# Altium project MVP-Module-Dash-v2.0.PrjPcb (part 8 of 8)
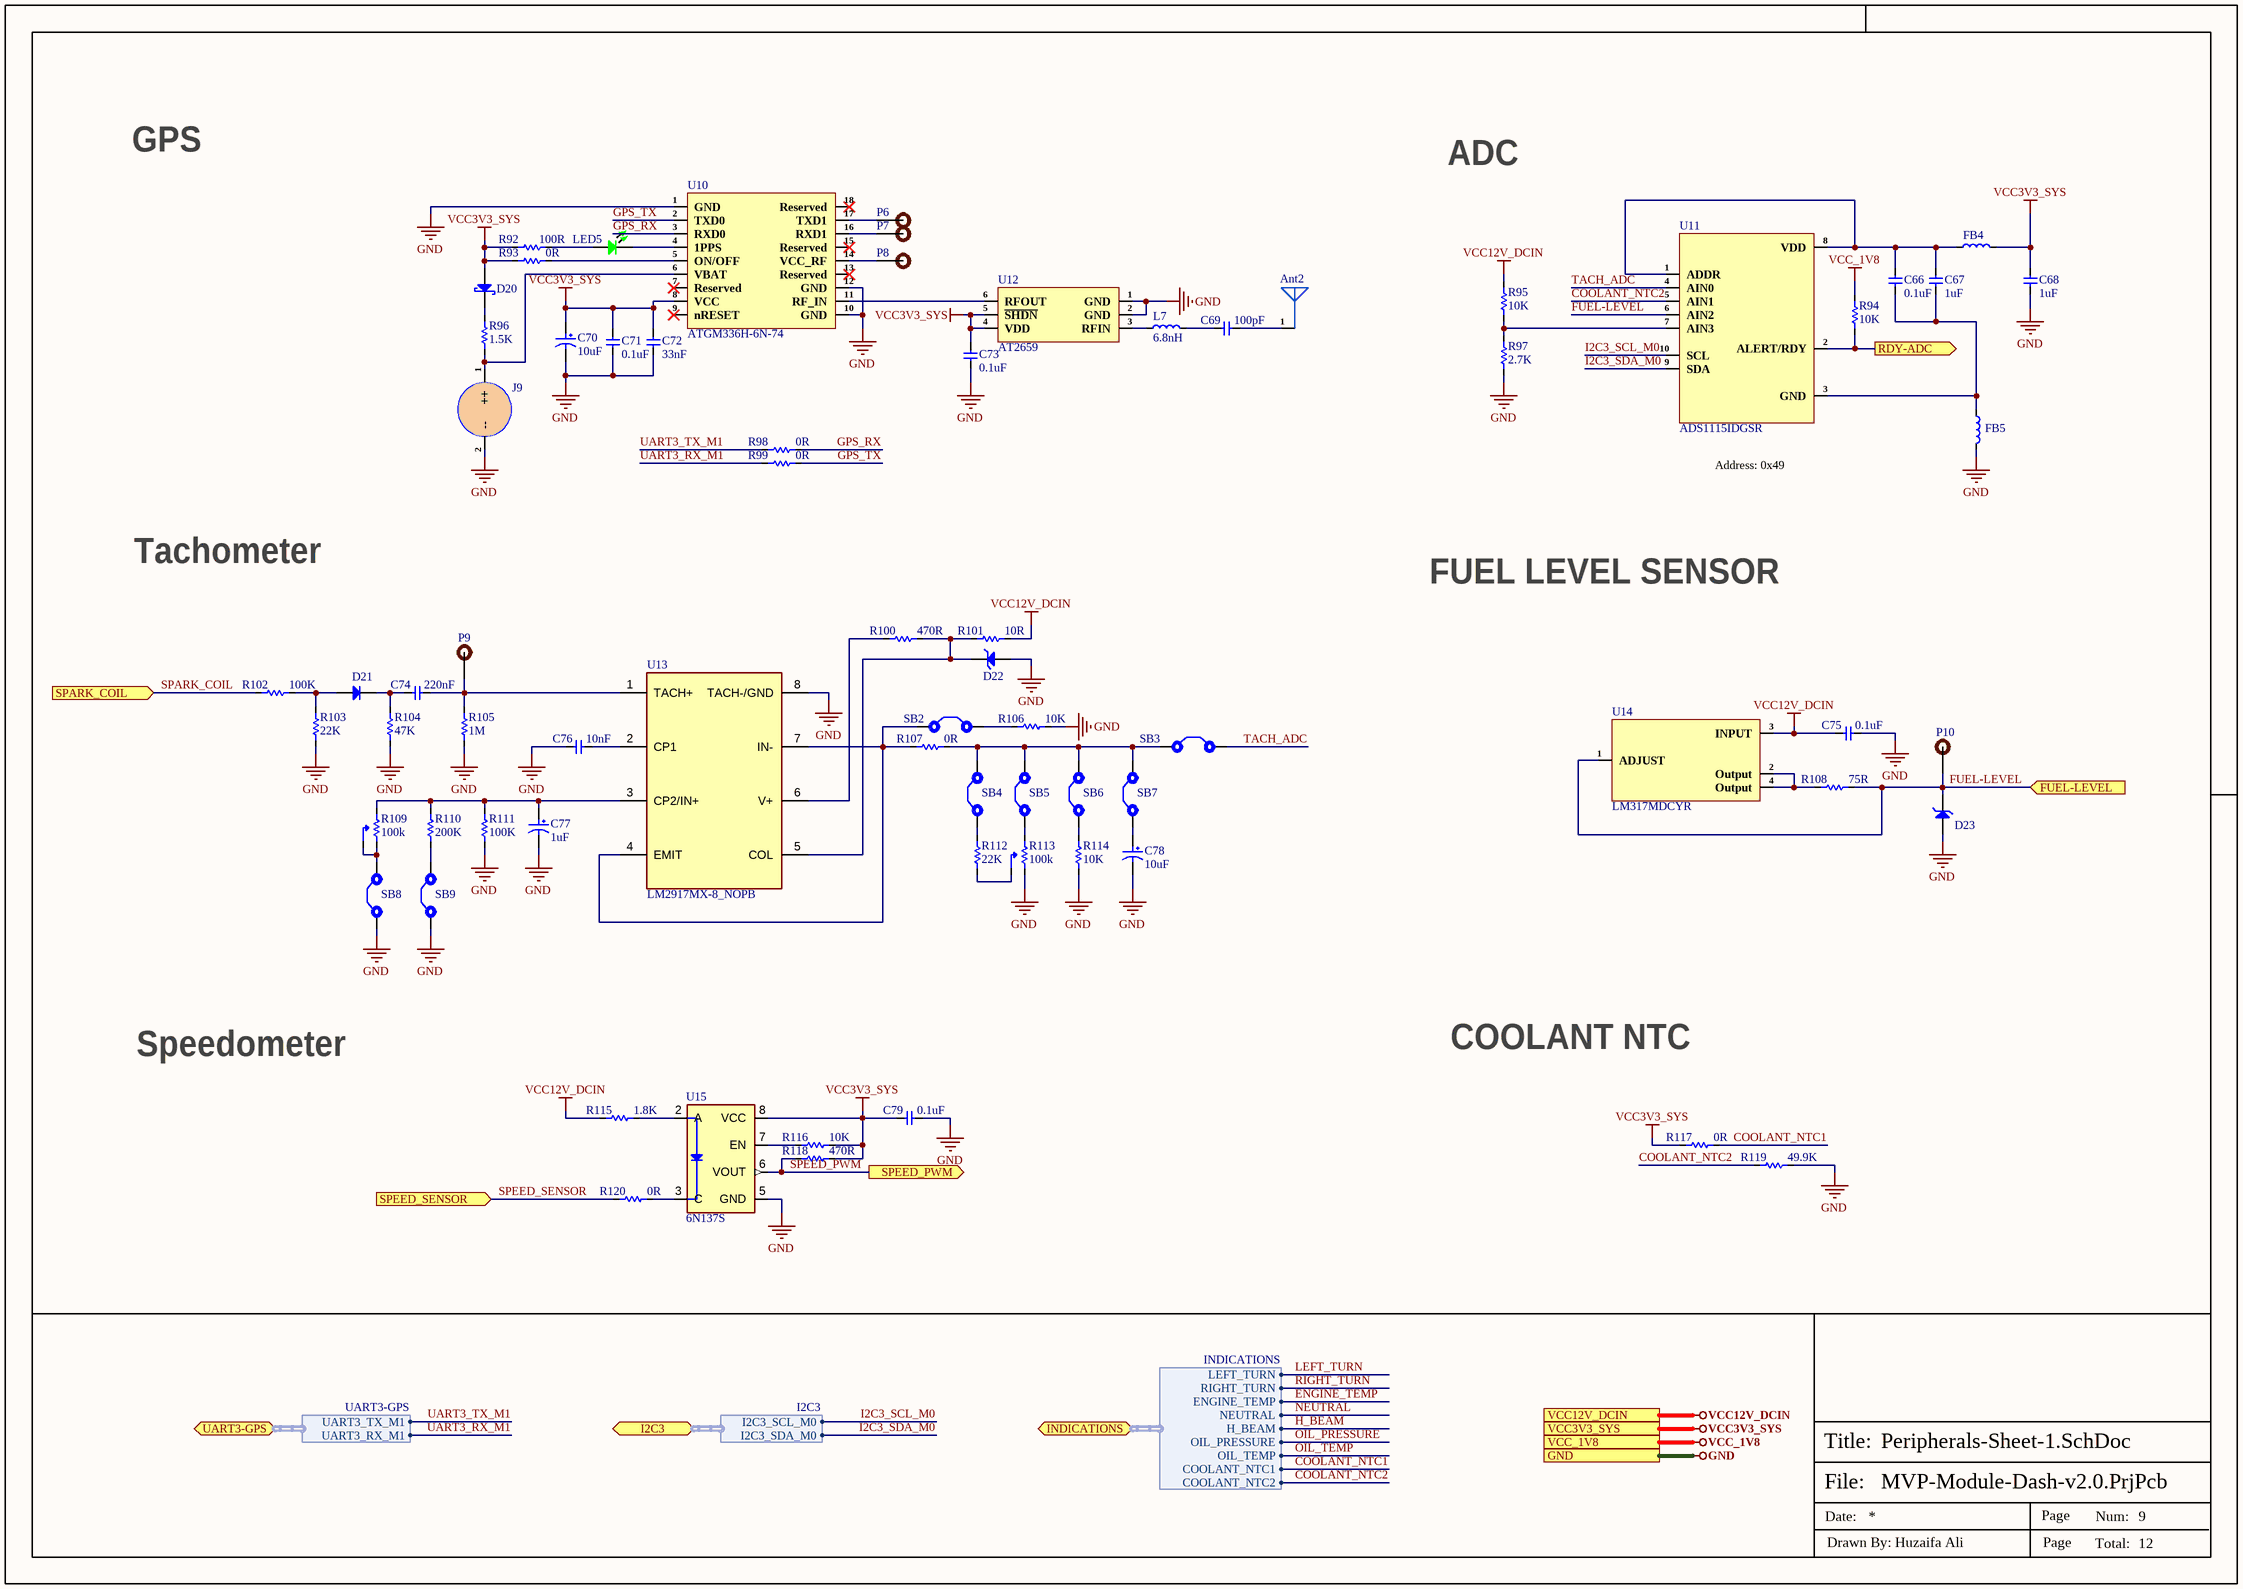
[diagram p15: Peripherals-Sheet-1.SchDoc]

## Sheet Peripherals-Sheet-1.SchDoc (continued)

### Library data of the parts (continued)
R111 = RC0402FR-07100KL: RES 100K OHM 1% 1/16W 0402; Manufacturer: Yageo; Resistance: 100kR; Temperature Coefficient: 100ppm/°C; Power Rating: 63mW; Voltage Rating: 50V; Item Type: Resistor; Supplier 1: Mouser; Manufacturer Part Number: RC0402FR-07100KL; RoHS: Yes; Category: Chip SMD Resistors; Stock 1: 7759549; Pricing 1: 1=0.10000, 10=0.01200, 50=0.01200, 100=0.00500, 1000=0.00300, 2500=0.00200, 10000=0.00100 (USD); Case/Package: 0402; Case Code (Metric): 1005; Case Code (Imperial): 0402; Min Operating Temperature: -55°C; Max Operating Temperature: 155°C; Resistor Type: Thick Film; Tolerance: 1%; Packaging: Tape and Reel; Package Quantity: 1; Number of Terminations: 2; Termination: SMD/SMT; Max Power Dissipation: 63mW; Working Voltage: 50V; Features: Moisture Resistant; Series: RC; Resistance Tolerance: 1%; Construction: Rectangular; Technology: THICK FILM; Length: 0.039inch; Width: 0.02inch; Height: 0.016inch; Depth: 0.5mm; REACH SVHC: No SVHC; Lead Free: Lead Free; RoHS Compliant: Yes; Military Standard: Not; ComponentLink1URL: https://datasheet.ciiva.com/11819/0900766b80c66297-11819452.pdf?src-supplier=RSComponents; ComponentLink1Description: https://datasheet.ciiva.com/11819/0900766b80c66297-11819452.pdf?src-supplier=RSComponents; ComponentLink2URL: https://datasheet.ciiva.com/22747/1018594-22747509.pdf?src-supplier=Element14; ComponentLink2Description: https://datasheet.ciiva.com/22747/1018594-22747509.pdf?src-supplier=Element14; ComponentLink3URL: https://datasheet.ciiva.com/2453/pyu-r-int-thick-7-2453362.pdf?src-supplier=Digi-Key; ComponentLink3Description: https://datasheet.ciiva.com/2453/pyu-r-int-thick-7-2453362.pdf?src-supplier=Digi-Key; ComponentLink4URL: https://datasheet.ciiva.com/2453/pyu-r-int-thick-7-2453363.pdf?src-supplier=Digi-Key; ComponentLink4Description: https://datasheet.ciiva.com/2453/pyu-r-int-thick-7-2453363.pdf?src-supplier=Digi-Key; ComponentLink5URL: https://datasheet.ciiva.com/2453/pyu-r-int-thick-7-2453361.pdf?src-supplier=Digi-Key; ComponentLink5Description: https://datasheet.ciiva.com/2453/pyu-r-int-thick-7-2453361.pdf?src-supplier=Digi-Key; ComponentLink6URL: https://datasheet.ciiva.com/12667/pyu-rc0402-51-rohs-l-6-r-12667930.pdf?src-supplier=Mouser; ComponentLink6Description: https://datasheet.ciiva.com/12667/pyu-rc0402-51-rohs-l-6-r-12667930.pdf?src-supplier=Mouser; ComponentLink7URL: https://datasheet.ciiva.com/15189/getdatasheetpartid-323696-15189334.pdf?src-supplier=Verical; ComponentLink7Description: https://datasheet.ciiva.com/15189/getdatasheetpartid-323696-15189334.pdf?src-supplier=Verical; Supplier Part Number 1: 603-RC0402FR-07100KL; LCSC Part Number: C60491
R115 = RC0402FR-071K8L: RES 1.8K OHM 1% 1/16W 0402; Manufacturer: Yageo; Item Type: Resistors; Supplier: Digikey; Supplier Part Number: 311-1.80KLRCT-ND; Manufacturer Part Number: RC0402FR-071K8L; RoHS: Yes; Stock: 584354; Pricing: 1=0.1, 10=0.015, 50=0.0088, 100=0.0073, 500=0.00488, 1000=0.00417, 5000=0.00297 (USD); Lead Free: 5697LeadFree; LCSC Part Number: C163481
R118 = RC0402FR-07470RL: RES 470 OHM 1% 1/16W 0402; Manufacturer: Yageo; Item Type: Resistor; Voltage Rating: 50V; Power Rating: 62.5mW; Temperature Coefficient: 100ppm/°C; Max Power Dissipation: 63mW; Supplier: Avnet; Supplier Part Number: RC0402FR-07470RL; Manufacturer Part Number: RC0402FR-07470RL; RoHS: Yes; Stock: 10000; Pricing: 10000=0.00085 (USD); Case/Package: 0402; Case Code (Metric): 1005; Case Code (Imperial): 0402; Min Operating Temperature: -55°C; Max Operating Temperature: 155°C; Packaging: Tape and Reel; Value: 470R; Tolerance: 1%; Number of Terminations: 2; Working Voltage: 50V; Package Quantity: 1; Resistor Type: Thick Film; Termination: SMD/SMT; Features: Moisture Resistant; Series: RC; Resistance Tolerance: 1%; Construction: Rectangular; Voltage Rating (AC): 50V; Length: 1mm; Width: 0.02inch; Height: 0.016inch; Depth: 0.5mm; Lead Free: Lead Free; Reach SVHC Compliant: No; RoHS Compliant: Yes; Military Standard: Not; ComponentLink1URL: https://datasheet.ciiva.com/46412/1018594-46412838.pdf?src-supplier=Element14; ComponentLink1Description: https://datasheet.ciiva.com/46412/1018594-46412838.pdf?src-supplier=Element14; ComponentLink2URL: https://datasheet.ciiva.com/2453/pyu-r-int-thick-7-2453377.pdf?src-supplier=Digikey; ComponentLink2Description: https://datasheet.ciiva.com/2453/pyu-r-int-thick-7-2453377.pdf?src-supplier=Digikey; ComponentLink3URL: https://datasheet.ciiva.com/2453/pyu-r-int-thick-7-2453378.pdf?src-supplier=Digikey; ComponentLink3Description: https://datasheet.ciiva.com/2453/pyu-r-int-thick-7-2453378.pdf?src-supplier=Digikey; ComponentLink4URL: https://datasheet.ciiva.com/2453/pyu-r-int-thick-7-2453376.pdf?src-supplier=Digikey; ComponentLink4Description: https://datasheet.ciiva.com/2453/pyu-r-int-thick-7-2453376.pdf?src-supplier=Digikey; ComponentLink5URL: https://datasheet.ciiva.com/7850/1018594-7850015.pdf?src-supplier=Element14; ComponentLink5Description: https://datasheet.ciiva.com/7850/1018594-7850015.pdf?src-supplier=Element14; ComponentLink6URL: https://datasheet.ciiva.com/7850/1018594-7850014.pdf?src-supplier=Element14; ComponentLink6Description: https://datasheet.ciiva.com/7850/1018594-7850014.pdf?src-supplier=Element14; ComponentLink7URL: https://datasheet.ciiva.com/15189/getdatasheetpartid-330246-15189463.pdf?src-supplier=Verical; ComponentLink7Description: https://datasheet.ciiva.com/15189/getdatasheetpartid-330246-15189463.pdf?src-supplier=Verical; LCSC Part Number: C114877
R119 = RC0402FR-0749K9L: RES 49.9K OHM 1% 1/16W 0402; Manufacturer: Yageo; Power Rating: 62.5mW; Value: 49.9kR; Voltage Rating: 50V; Temperature Coefficient: 100ppm/°C; Max Power Dissipation: 63mW; Item Type: Resistor; Supplier: Digikey; Supplier Part Number: 311-49.9KLRCT-ND; Manufacturer Part Number: RC0402FR-0749K9L; RoHS: Yes; Category: Chip SMD Resistors; Stock: 5084418; Pricing: 1=0.1, 10=0.015, 50=0.0088, 100=0.0073, 500=0.00488, 1000=0.00417, 5000=0.00297 (USD); Case/Package: 0402; Case Code (Imperial): 0402; Case Code (Metric): 1005; Min Operating Temperature: -55°C; Max Operating Temperature: 155°C; Tolerance: 1%; Packaging: Tape and Reel; Termination: SMD/SMT; Voltage Rating (DC): 50V; Features: Moisture Resistant; Series: RC; Number of Terminations: 2; Construction: Rectangular; Length: 1mm; Depth: 0.5mm; RoHS Compliant: Yes; Military Standard: Not; Lead Free: Lead Free; ComponentLink1URL: https://datasheet.ciiva.com/17071/pyu-rc0402-51-rohs-l-6-r-17071066.pdf?src-supplier=Future+Electronics; ComponentLink1Description: https://datasheet.ciiva.com/17071/pyu-rc0402-51-rohs-l-6-r-17071066.pdf?src-supplier=Future+Electronics; LCSC Part Number: C137969
R120 = RC0402FR-070RL: RES 0 OHM JUMPER 1/16W 0402; Manufacturer: Yageo; Item Type: Resistors; Tolerance: 1%; Power Rating: 62.5mW; Voltage Rating: 50V; Temperature Coefficient: 200ppm/°C; Max Power Dissipation: 63mW; Supplier 1: Mouser; Manufacturer Part Number: RC0402FR-070RL; RoHS: Yes; Stock 1: 8556842; Pricing 1: 1=0.10000, 10=0.01400, 50=0.01400, 100=0.00600, 1000=0.00300, 5000=0.00200, 10000=0.00100 (USD); Mount: Surface Mount; Case/Package: 0402; Contact Plating: Tin,Matte; Case Code (Imperial): 0402; Case Code (Metric): 1005; Size Code: 0402; Min Operating Temperature: -55°C; Max Operating Temperature: 155°C; Resistance: 0R; Resistor Type: Thick Film; Packaging: Tape and Reel; Termination: SMD/SMT; Features: Moisture Resistant; Series: RC; Number of Terminations: 2; Length: 1mm; Width: 0.5mm; Height: 0.35mm; Radiation Hardening: No; Lead Free: Lead Free; RoHS Compliant: Yes; ComponentLink1URL: https://datasheet.ciiva.com/8896/pyu-rc0402-51-rohs-l-6-8896149.pdf?src-supplier=Avnet; ComponentLink1Description: https://datasheet.ciiva.com/8896/pyu-rc0402-51-rohs-l-6-8896149.pdf?src-supplier=Avnet; ComponentLink2URL: https://datasheet.ciiva.com/16790/pyu-rc0402-51-rohs-l-6-r-16790444.pdf?src-supplier=Future+Electronics; ComponentLink2Description: https://datasheet.ciiva.com/16790/pyu-rc0402-51-rohs-l-6-r-16790444.pdf?src-supplier=Future+Electronics; Supplier Part Number 1: 603-RC0402FR-070RL; LCSC Part Number: C106231
SB2-SB9 = Solder Bridge 0603: Solder Bridge ON; Manufacturer Part Number: Solder Bridge; Item Type: Solder Bridge
U10 = ATGM336H-6N-74: SMD,10.1x9.7mm Satellite Positioning Modules ROHS; Manufacturer: ZHONGKEWEI; Manufacturer Part Number: ATGM336H-6N-74; Package: SMD,10.1x9.7mm; LCSC Part Number: C5804601; ComponentLink1Description: LCSC; ComponentLink1URL: https://www.lcsc.com/product-detail/Satellite-Positioning-Modules_ZHONGKEWEI-ATGM336H-6N-74_C5804601.html
U11 = ADS1115IDGSR: IC ADC 16BIT SIGMA-DELTA 10VSSOP; Manufacturer: Texas Instruments; Interface: I2C; Number of Bits: 16; Sampling Rate: 860S/s; Number of A/D Converters: 1; Resolution: 16b; Polarity: Bipolar; Min Supply Voltage: 2V; Max Supply Voltage: 5.5V; Supply Type: Single; Conversion Rate: 0.86KS/s; Number of Inputs: 4; Integral Nonlinearity (INL): 1LSB; Power Dissipation: 900uW; Nominal Supply Current: 150uA; Number of Channels: 2; Supplier: Mouser; Supplier Part Number: 595-ADS1115IDGSR; Manufacturer Part Number: ADS1115IDGSR; RoHS: Yes; Category: Analog to Digital Converters (ADCs); Stock: 5925; Pricing: 1=5.44, 10=4.76, 50=4.76, 100=4.01, 1000=2.88, 10000=2.78 (USD); Case/Package: VSSOP; Pins: 10; Contact Plating: Gold; Min Operating Temperature: -40°C; Max Operating Temperature: 125°C; Package Quantity: 2500; Packaging: Tape and Reel; Number of Converters: 1; Max Supply Voltage (DC): 5.5V; Min Supply Voltage (DC): 2V; Series: -; Length: 3mm; Width: 3mm; Height: 1.07mm; Thickness: 1.02mm; Reach SVHC Compliant: No; Lead Free: Lead Free; RoHS Compliant: Yes; ComponentLink1URL: https://datasheet.ciiva.com/4031/47725463s8438921n7713-4031028.pdf?src-supplier=Arrow+Electronics; ComponentLink1Description: https://datasheet.ciiva.com/4031/47725463s8438921n7713-4031028.pdf?src-supplier=Arrow+Electronics; LCSC Part Number: C37593; Item Type: IC
U12 = AT2659: 1.4V~3.6V 4.3mA DFN-6(1x1.6) Low Noise Amplifiers (LNA) - RF ROHS; Manufacturer: ZHONGKEWEI; Manufacturer Part Number: AT2659; Package: DFN-6(1x1.6); LCSC Part Number: C92450; Item Type: LNA; ComponentLink1Description: LCSC; ComponentLink1URL: https://www.lcsc.com/product-detail/Low-Noise-Amplifiers-LNA-RF_ZHONGKEWEI-AT2659_C92450.html
U13 = LM2917MX-8_NOPB: Frequency to Voltage Converter; Manufacturer_Name: Texas Instruments; Manufacturer_Part_Number: LM2917MX-8/NOPB; Geometry.Height: 1.75mm; Mouser Part Number: 926-LM2917MX-8/NOPB; Mouser Price/Stock: https://www.mouser.co.uk/ProductDetail/Texas-Instruments/LM2917MX-8-NOPB?qs=X1J7HmVL2ZFWM%2FK6eX0xZQ%3D%3D; Datasheet Link: http://www.ti.com/lit/gpn/LM2917-N
U14 = LM317MDCYR: IC REG LIN POS ADJ 500MA SOT223; Manufacturer: Texas Instruments; Output Voltage: 37V; Number of Outputs: 1; Min Input Voltage: 4.2V; Max Supply Voltage: 40V; Polarity: Positive; Min Output Voltage: 1.25V; Quiescent Current: 3.5mA; Output Type: Adjustable; Reference Voltage: 1.3V; Power Supply Rejection Ratio (PSRR): 80dB; Supplier: Mouser; Supplier Part Number: 595-LM317MDCYR; Manufacturer Part Number: LM317MDCYR; RoHS: Yes; Category: Voltage Regulators - Linear; Stock: 12890; Pricing: 1=0.67, 10=0.564, 50=0.564, 100=0.428, 500=0.359, 1000=0.283, 2500=0.263, 5000=0.245, 10000=0.236, 25000=0.227 (USD); Mounting Technology: Surface Mount; Case/Package: SOT-223-4; Pins: 4; Weight: 0.006632oz; Min Operating Temperature: -40°C; Max Operating Temperature: 125°C; Packaging: Tape and Reel; Output Current: 500mA; Number of Regulators: 1; Max Output Voltage: 37V; Package Quantity: 1; Max Output current: 500mA; Series: -; Radiation Hardening: No; Reach SVHC Compliant: No; Lead Free: Lead Free; RoHS Compliant: Yes; ComponentLink1URL: https://datasheet.ciiva.com/1643/755612-1643356.pdf?src-supplier=Newark; ComponentLink1Description: https://datasheet.ciiva.com/1643/755612-1643356.pdf?src-supplier=Newark; ComponentLink2URL: https://datasheet.ciiva.com/41458/001014040-da-01-en-ic-reg-adj-0-5-lm317mdcyr-sot-223-4-tid-41458215.pdf?src-supplier=Conrad; ComponentLink2Description: https://datasheet.ciiva.com/41458/001014040-da-01-en-ic-reg-adj-0-5-lm317mdcyr-sot-223-4-tid-41458215.pdf?src-supplier=Conrad; ComponentLink3URL: https://datasheet.ciiva.com/1512/1814942-1512040.pdf?src-supplier=Element14; ComponentLink3Description: https://datasheet.ciiva.com/1512/1814942-1512040.pdf?src-supplier=Element14; ComponentLink4URL: https://datasheet.ciiva.com/46398/755612-46398903.pdf?src-supplier=Element14; ComponentLink4Description: https://datasheet.ciiva.com/46398/755612-46398903.pdf?src-supplier=Element14; ComponentLink5URL: https://datasheet.ciiva.com/46419/1814942-46419370.pdf?src-supplier=Element14; ComponentLink5Description: https://datasheet.ciiva.com/46419/1814942-46419370.pdf?src-supplier=Element14; ComponentLink6URL: https://datasheet.ciiva.com/2042/lm317m-2042100.pdf?src-supplier=Digikey; ComponentLink6Description: https://datasheet.ciiva.com/2042/lm317m-2042100.pdf?src-supplier=Digikey; ComponentLink7URL: https://datasheet.ciiva.com/2042/lm317m-2042099.pdf?src-supplier=Digikey; ComponentLink7Description: https://datasheet.ciiva.com/2042/lm317m-2042099.pdf?src-supplier=Digikey; ComponentLink8URL: https://datasheet.ciiva.com/2042/lm317m-2042101.pdf?src-supplier=Digikey; ComponentLink8Description: https://datasheet.ciiva.com/2042/lm317m-2042101.pdf?src-supplier=Digikey; ComponentLink9URL: https://datasheet.ciiva.com/14280/lm317mq-14280776.pdf?src-supplier=Avnet; ComponentLink9Description: https://datasheet.ciiva.com/14280/lm317mq-14280776.pdf?src-supplier=Avnet; LCSC Part Number: C840113; Item Type: IC
U15 = 6N137S: Logic Output Optoisolator 15MBd Open Collector 5000Vrms 1 Channel 10kV/Âµs CMTI 8-SMD; MF: Lite-On Electronics; SnapEDA_Link: https://www.snapeda.com/parts/6N137S/Applied+Avionics/view-part/?ref=snap; Package: SMD-8 Lite-On Inc.; Value: *; MP: 6N137S; Check_prices: https://www.snapeda.com/parts/6N137S/Applied+Avionics/view-part/?ref=eda

## Sheet Peripherals-Sheet-2.SchDoc
size 420 x 297 mm; SheetNumber: 10; SheetTotal: 12
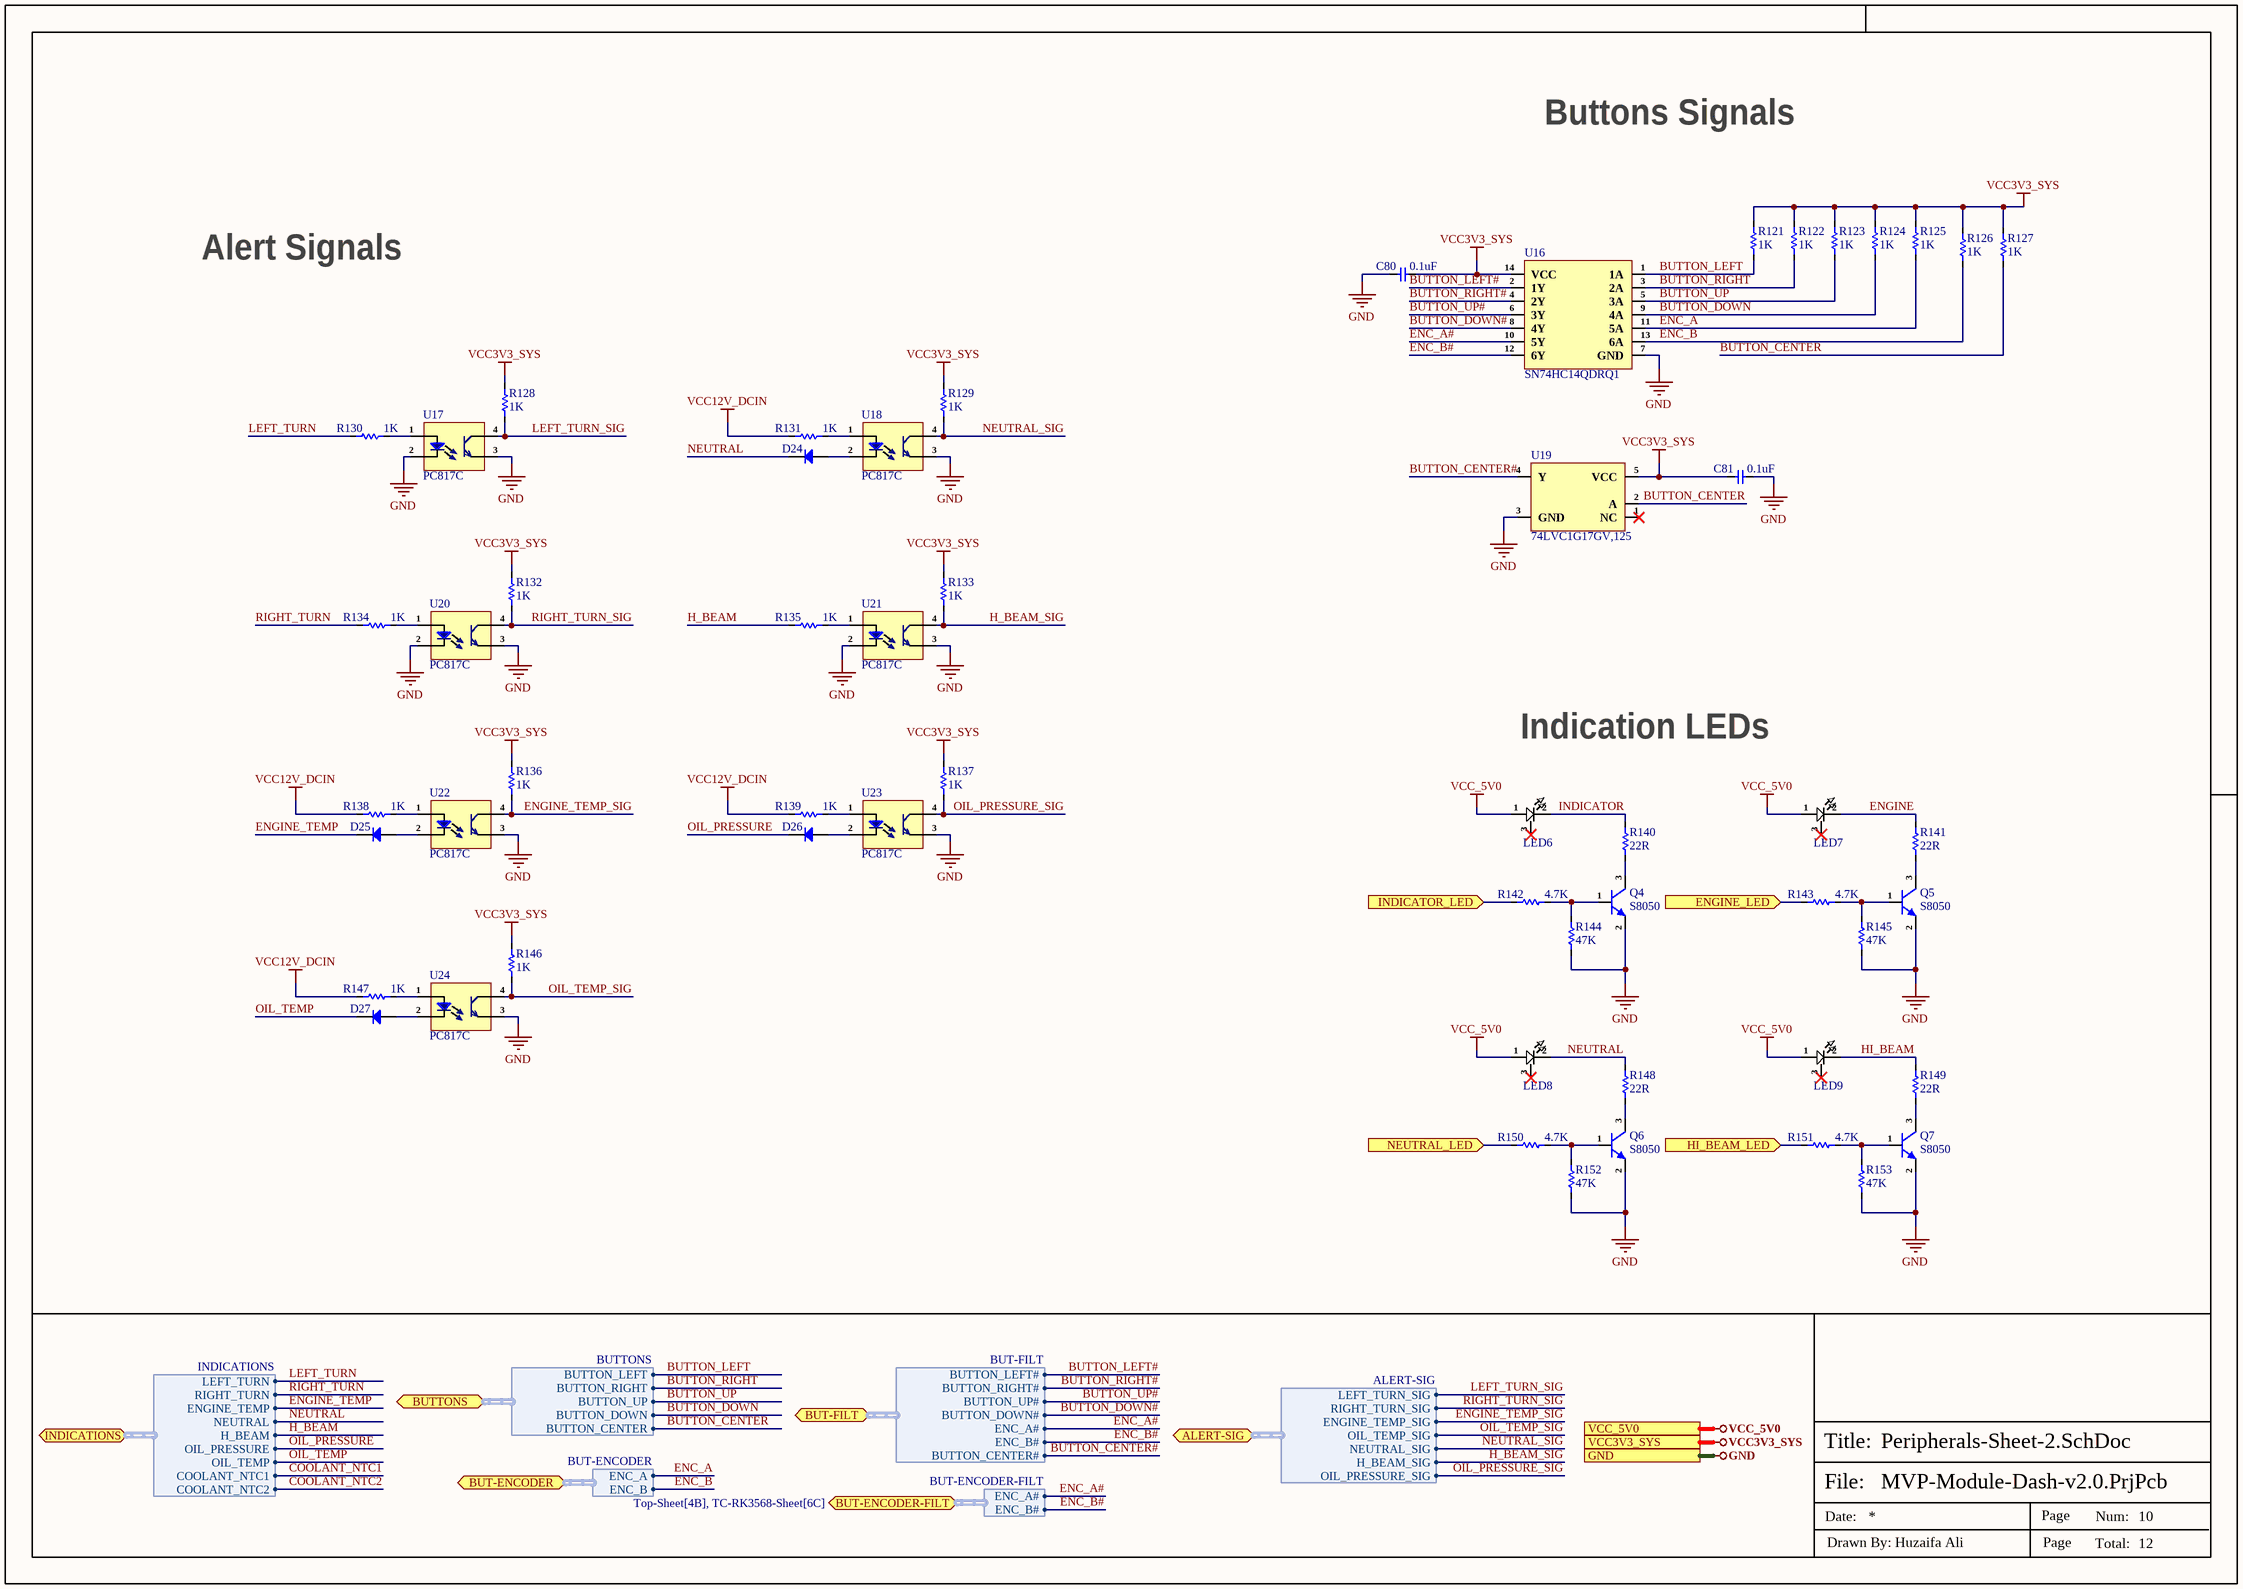
[diagram p12: Peripherals-Sheet-2.SchDoc]

### Parts
C80  0.1uF  [Cap-0402]
C81  0.1uF  [Cap-0402]
D24  1N4148W  [SOD-123]  (value not drawn)
D25  1N4148W  [SOD-123]  (value not drawn)
D26  1N4148W  [SOD-123]  (value not drawn)
D27  1N4148W  [SOD-123]  (value not drawn)
LED6  WHITE  [GW CS8PM1.PM-LRLT-XX52-1-350-R18]  (value not drawn)
LED7  WHITE  [GW CS8PM1.PM-LRLT-XX52-1-350-R18]  (value not drawn)
LED8  WHITE  [GW CS8PM1.PM-LRLT-XX52-1-350-R18]  (value not drawn)
LED9  WHITE  [GW CS8PM1.PM-LRLT-XX52-1-350-R18]  (value not drawn)
Q4  S8050  [SOT-23]
Q5  S8050  [SOT-23]
Q6  S8050  [SOT-23]
Q7  S8050  [SOT-23]
R121  1K  [Res-0402]
R122  1K  [Res-0402]
R123  1K  [Res-0402]
R124  1K  [Res-0402]
R125  1K  [Res-0402]
R126  1K  [Res-0402]
R127  1K  [Res-0402]
R128  1K  [Res-0402]
R129  1K  [Res-0402]
R130  1K  [Res-0402]
R131  1K  [Res-0402]
R132  1K  [Res-0402]
R133  1K  [Res-0402]
R134  1K  [Res-0402]
R135  1K  [Res-0402]
R136  1K  [Res-0402]
R137  1K  [Res-0402]
R138  1K  [Res-0402]
R139  1K  [Res-0402]
R140  22R  [RES-2010]
R141  22R  [RES-2010]
R142  4.7K  [Res-0402]
R143  4.7K  [Res-0402]
R144  47K  [Res-0402]
R145  47K  [Res-0402]
R146  1K  [Res-0402]
R147  1K  [Res-0402]
R148  22R  [RES-2010]
R149  22R  [RES-2010]
R150  4.7K  [Res-0402]
R151  4.7K  [Res-0402]
R152  47K  [Res-0402]
R153  47K  [Res-0402]
U16  SN74HC14QDRQ1  [SOIC-14]
U17  PC817C  [PC817C]
U18  PC817C  [PC817C]
U19  74LVC1G17GV,125  [SC-74A]
U20  PC817C  [PC817C]
U21  PC817C  [PC817C]
U22  PC817C  [PC817C]
U23  PC817C  [PC817C]
U24  PC817C  [PC817C]

### Ports
ALERT-SIG (bidir, harness ALERT-SIG, see Top-Sheet[4B], TC-RK3568-Sheet[5B]), BUT-ENCODER (bidir, harness BUT-ENCODER, see Top-Sheet[6B], Connector-Sheet[4D]), BUT-ENCODER-FILT (bidir, harness BUT-ENCODER-FILT, see Top-Sheet[4B], TC-RK3568-Sheet[6C]), BUT-FILT (bidir, harness BUT-FILT, see Top-Sheet[4B], TC-RK3568-Sheet[5B]), BUTTONS (bidir, harness BUTTONS, see Top-Sheet[6B], Connector-Sheet[2D]), ENGINE_LED (in, see Top-Sheet[4B], TC-RK3568-Sheet[5C]), GND (see Top-Sheet[6B], CAN-Debug-Sheet[5D], Connector-Sheet[5D], HDMI-Sheet[5D], MIPI-Display-Sheet[5D], Peripherals-Sheet-1[5D], Power-Sheet[5D], TC-RK3568-Sheet[5D], TF-Card-Sheet[4D], USB-Sheet[5D], WiFi-Sheet[4D]), HI_BEAM_LED (in, see Top-Sheet[4B], TC-RK3568-Sheet[5C]), INDICATIONS (bidir, harness INDICATIONS, see Top-Sheet[6B], Connector-Sheet[1D], Peripherals-Sheet-1[3D]), INDICATOR_LED (in, see Top-Sheet[4B], TC-RK3568-Sheet[5C]), NEUTRAL_LED (in, see Top-Sheet[4B], TC-RK3568-Sheet[5C]), VCC3V3_SYS (see Top-Sheet[6B], Peripherals-Sheet-1[5D], Power-Sheet[5D], TC-RK3568-Sheet[5D], WiFi-Sheet[4D]), VCC_5V0 (see Top-Sheet[6B], CAN-Debug-Sheet[5D], HDMI-Sheet[5D], MIPI-Display-Sheet[5D], Power-Sheet[5D])

### Harnesses
INDICATIONS: LEFT_TURN, RIGHT_TURN, ENGINE_TEMP, NEUTRAL, H_BEAM, OIL_PRESSURE, OIL_TEMP, COOLANT_NTC1, COOLANT_NTC2
BUTTONS: BUTTON_LEFT, BUTTON_RIGHT, BUTTON_UP, BUTTON_DOWN, BUTTON_CENTER
BUT-ENCODER: ENC_A, ENC_B
BUT-FILT: BUTTON_LEFT#, BUTTON_RIGHT#, BUTTON_UP#, BUTTON_DOWN#, ENC_A#, ENC_B#, BUTTON_CENTER#
ALERT-SIG: LEFT_TURN_SIG, RIGHT_TURN_SIG, ENGINE_TEMP_SIG, OIL_TEMP_SIG, NEUTRAL_SIG, H_BEAM_SIG, OIL_PRESSURE_SIG
BUT-ENCODER-FILT: ENC_A#, ENC_B#

### Nets
GND: C80.2 C81.1 Q4.2(E) Q5.2(E) Q6.2(E) Q7.2(E) R144.1 R145.1 R152.1 R153.1 U16.7(GND) U17.2(Ca) U17.3(E) U18.3(E) U19.3(GND) U20.2(Ca) U20.3(E) U21.2(Ca) U21.3(E) U22.3(E) U23.3(E) U24.3(E) ; port GND
VCC3V3_SYS: C80.1 C81.2 R121.2 R122.2 R123.2 R124.2 R125.2 R126.2 R127.2 R128.2 R129.2 R132.2 R133.2 R136.2 R137.2 R146.2 U16.14(VCC) U19.5(VCC) ; port VCC3V3_SYS
VCC12V_DCIN: R131.1 R138.1 R139.1 R147.1
VCC_5V0: LED6.1 LED7.1 LED8.1 LED9.1 ; port VCC_5V0
BUTTON_CENTER: R127.1 U19.2(A) ; port BUTTONS.BUTTON_CENTER
BUTTON_CENTER#: U19.4(Y) ; port BUT-FILT.BUTTON_CENTER#
BUTTON_DOWN: R124.1 U16.9(4A) ; port BUTTONS.BUTTON_DOWN
BUTTON_DOWN#: U16.8(4Y) ; port BUT-FILT.BUTTON_DOWN#
BUTTON_LEFT: R121.1 U16.1(1A) ; port BUTTONS.BUTTON_LEFT
BUTTON_LEFT#: U16.2(1Y) ; port BUT-FILT.BUTTON_LEFT#
BUTTON_RIGHT: R122.1 U16.3(2A) ; port BUTTONS.BUTTON_RIGHT
BUTTON_RIGHT#: U16.4(2Y) ; port BUT-FILT.BUTTON_RIGHT#
BUTTON_UP: R123.1 U16.5(3A) ; port BUTTONS.BUTTON_UP
BUTTON_UP#: U16.6(3Y) ; port BUT-FILT.BUTTON_UP#
ENC_A: R125.1 U16.11(5A) ; port BUT-ENCODER.ENC_A
ENC_A#: U16.10(5Y) ; port BUT-FILT.ENC_A#, port BUT-ENCODER-FILT.ENC_A#
ENC_B: R126.1 U16.13(6A) ; port BUT-ENCODER.ENC_B
ENC_B#: U16.12(6Y) ; port BUT-FILT.ENC_B#, port BUT-ENCODER-FILT.ENC_B#
ENGINE: LED7.2 R141.2
ENGINE_TEMP: D25.2(K) ; port INDICATIONS.ENGINE_TEMP
ENGINE_TEMP_SIG: R136.1 U22.4(C) ; port ALERT-SIG.ENGINE_TEMP_SIG
H_BEAM: R135.1 ; port INDICATIONS.H_BEAM
H_BEAM_SIG: R133.1 U21.4(C) ; port ALERT-SIG.H_BEAM_SIG
HI_BEAM: LED9.2 R149.2
INDICATOR: LED6.2 R140.2
LEFT_TURN: R130.1 ; port INDICATIONS.LEFT_TURN
LEFT_TURN_SIG: R128.1 U17.4(C) ; port ALERT-SIG.LEFT_TURN_SIG
NEUTRAL: D24.2(K) LED8.2 R148.2 ; port INDICATIONS.NEUTRAL
NEUTRAL_SIG: R129.1 U18.4(C) ; port ALERT-SIG.NEUTRAL_SIG
OIL_PRESSURE: D26.2(K) ; port INDICATIONS.OIL_PRESSURE
OIL_PRESSURE_SIG: R137.1 U23.4(C) ; port ALERT-SIG.OIL_PRESSURE_SIG
OIL_TEMP: D27.2(K) ; port INDICATIONS.OIL_TEMP
OIL_TEMP_SIG: R146.1 U24.4(C) ; port ALERT-SIG.OIL_TEMP_SIG
RIGHT_TURN: R134.1 ; port INDICATIONS.RIGHT_TURN
RIGHT_TURN_SIG: R132.1 U20.4(C) ; port ALERT-SIG.RIGHT_TURN_SIG
NetD24_1: D24.1(A) U18.2(Ca)
NetD25_1: D25.1(A) U22.2(Ca)
NetD26_1: D26.1(A) U23.2(Ca)
NetD27_1: D27.1(A) U24.2(Ca)
NetM1_59: R142.1 ; port INDICATOR_LED
NetM1_60: R150.1 ; port NEUTRAL_LED
NetM1_61: R143.1 ; port ENGINE_LED
NetM1_62: R151.1 ; port HI_BEAM_LED
NetQ4_1: Q4.1(B) R142.2 R144.2
NetQ4_3: Q4.3(C) R140.1
NetQ5_1: Q5.1(B) R143.2 R145.2
NetQ5_3: Q5.3(C) R141.1
NetQ6_1: Q6.1(B) R150.2 R152.2
NetQ6_3: Q6.3(C) R148.1
NetQ7_1: Q7.1(B) R151.2 R153.2
NetQ7_3: Q7.3(C) R149.1
NetR130_2: R130.2 U17.1(An)
NetR131_2: R131.2 U18.1(An)
NetR134_2: R134.2 U20.1(An)
NetR135_2: R135.2 U21.1(An)
NetR138_2: R138.2 U22.1(An)
NetR139_2: R139.2 U23.1(An)
NetR147_2: R147.2 U24.1(An)

Not connected (* = marked no-connect by the designer): LED6 3*; LED7 3*; LED8 3*; LED9 3*; U19 1(NC)*

### Notes on the sheet
- Buttons Signals
- Alert Signals
- Indication LEDs
- File:
- Title:
- Date:
- Page
- Num:
- Total:
- Drawn By: Huzaifa Ali

### Library data of the parts
C80 C81 = CC0402KRX5R6BB104: CAP CER 0.1UF 10V X5R 0402; Manufacturer: Yageo; Capacitance: 100nF; Tolerance: 10%; Dissipation Factor: 5%; Insulation Resistance: 10GR; Item Type: Capacitor; Supplier 1: Digi-Key; Manufacturer Part Number: CC0402KRX5R6BB104; RoHS: Yes; Category: Ceramic Capacitors; Stock 1: 6385580; Pricing 1: 1=0.10000, 10=0.02700, 50=0.01500, 100=0.01220, 500=0.00874, 1000=0.00687, 2500=0.00625, 5000=0.00575 (USD); Mount: Surface Mount; Case/Package: 0402; Number of Pins: 2; Case Code (Imperial): 0402; Case Code (Metric): 1005; Min Operating Temperature: -55°C; Max Operating Temperature: 85°C; Dielectric: X5R; Packaging: Tape and Reel; Voltage Rating: 10V; Package Quantity: 1; Termination: SMD/SMT; Voltage Rating (DC): 10V; Series: CC; Length: 1mm; Width: 0.02inch; Height: 0.5mm; Depth: 0.5mm; Thickness: 0.022inch; Radiation Hardening: No; RoHS Compliant: Yes; REACH SVHC: No SVHC; Lead Free: Lead Free; Halogen Free: Halogen Free; ComponentLink1URL: https://datasheet.ciiva.com/144/mlccorderingcode-144029.pdf?src-supplier=Digi-Key; ComponentLink1Description: https://datasheet.ciiva.com/144/mlccorderingcode-144029.pdf?src-supplier=Digi-Key; ComponentLink2URL: https://datasheet.ciiva.com/144/mlccorderingcode-144028.pdf?src-supplier=Digi-Key; ComponentLink2Description: https://datasheet.ciiva.com/144/mlccorderingcode-144028.pdf?src-supplier=Digi-Key; ComponentLink3URL: https://datasheet.ciiva.com/144/mlccorderingcode-144030.pdf?src-supplier=Digi-Key; ComponentLink3Description: https://datasheet.ciiva.com/144/mlccorderingcode-144030.pdf?src-supplier=Digi-Key; ComponentLink4URL: https://datasheet.ciiva.com/7978/1359354-7978091.pdf?src-supplier=Element14; ComponentLink4Description: https://datasheet.ciiva.com/7978/1359354-7978091.pdf?src-supplier=Element14; ComponentLink5URL: https://datasheet.ciiva.com/11587/upy-gphc-x5r-4v-to-50v-12-11587302.pdf?src-supplier=Avnet; ComponentLink5Description: https://datasheet.ciiva.com/11587/upy-gphc-x5r-4v-to-50v-12-11587302.pdf?src-supplier=Avnet; Supplier Part Number 1: 311-1336-1-ND; LCSC Part Number: C129131
D24-D27 = 1N4148W: 100V 400mW Single 1.25V@150mA 8ns 300mA SOD-123 Switching Diode ROHS; Manufacturer: JSMSEMI; ComponentLink1Description: LCSC; ComponentLink1URL: https://www.lcsc.com/product-detail/Switching-Diode_JSMSEMI-1N4148W_C917030.html; Manufacturer Part Number: 1N4148W; Package: SOD-123; LCSC Part Number: C917030; Item Type: Diode
LED6-LED9 = GW-CS8PM1.PM-LRLT-XX52-1-350-R18: White LED 350mA Cool 5700K 80° 1212
Q4-Q7 = S8050: Trans Gp Bjt NPN 25V 1.5A 300MW 3-PIN SOT-23 T/r; Manufacturer: Comchip; Manufacturer Part Number: SS8050-G; Collector Emitter Voltage (VCEO): 400mV; Transition Frequency: 100MHz; Item Type: Transistor; Supplier 1: Arrow Electronics; RoHS: Yes; Stock 1: 2514; Pricing 1: 1=0.26480, 10=0.19960, 25=0.19760, 50=0.19590, 100=0.09990, 250=0.09890, 500=0.07670, 1000=0.05180 (USD); Mount: Surface Mount; Case/Package: TO-236-3; Packaging: Tape and Reel; Max Power Dissipation: 300mW; Max Collector Current: 1.5A; Collector Emitter Breakdown Voltage: 25V; Max Breakdown Voltage: 25V; ComponentLink1URL: http://www.comchiptech.com/admin/files/product/SS8050-G RevA181526.pdf?src-supplier=Digi-Key; ComponentLink1Description: http://www.comchiptech.com/admin/files/product/SS8050-G RevA181526.pdf?src-supplier=Digi-Key; ComponentLink2URL: http://www.comchiptech.com/cms/UserFiles/SS8050-G%20RevA181526.pdf?src-supplier=Digi-Key; ComponentLink2Description: http://www.comchiptech.com/cms/UserFiles/SS8050-G%20RevA181526.pdf?src-supplier=Digi-Key; Supplier Part Number 1: SS8050-G; LCSC Part Number: C105433
R121-R139 R146 R147 = RC0402FR-071KL: RES 1K OHM 1% 1/16W 0402; Manufacturer: Yageo; Resistance: 1kR; Temperature Coefficient: 100ppm/°C; Voltage Rating (DC): 50V; Power Rating: 62.5mW; Max Power Dissipation: 63mW; Item Type: Resistor; Supplier 1: Avnet; Manufacturer Part Number: RC0402FR-071KL; RoHS: Yes; Category: Chip SMD Resistors; Stock 1: 13030000; Pricing 1: 10000=0.00085, 20000=0.00087, 40000=0.00084, 60000=0.00083, 80000=0.00079, 100000=0.00078, 1000000=0.00076 (USD); Case/Package: 0402; Number of Pins: 2; Case Code (Imperial): 0402; Case Code (Metric): 1005; Size Code: 0402; Min Operating Temperature: -55°C; Max Operating Temperature: 155°C; Resistor Type: Thick Film; Tolerance: 1%; Packaging: Tape and Reel; Voltage Rating: 50V; Termination: SMD/SMT; Features: Moisture Resistant; Series: RC; Number of Terminations: 2; Resistance Tolerance: 1%; Construction: Rectangular; Technology: THICK FILM; Length: 1mm; Width: 0.5mm; Height: 0.32mm; Depth: 0.5mm; Reach SVHC Compliant: Yes; Lead Free: Lead Free; RoHS Compliant: Yes; Military Standard: Not; ComponentLink1URL: https://datasheet.ciiva.com/11819/0900766b80c66297-11819477.pdf?src-supplier=RSComponents; ComponentLink1Description: https://datasheet.ciiva.com/11819/0900766b80c66297-11819477.pdf?src-supplier=RSComponents; ComponentLink2URL: https://datasheet.ciiva.com/7983/1018594-7983502.pdf?src-supplier=Element14; ComponentLink2Description: https://datasheet.ciiva.com/7983/1018594-7983502.pdf?src-supplier=Element14; ComponentLink3URL: https://datasheet.ciiva.com/22747/1018594-22747513.pdf?src-supplier=Element14; ComponentLink3Description: https://datasheet.ciiva.com/22747/1018594-22747513.pdf?src-supplier=Element14; ComponentLink4URL: https://datasheet.ciiva.com/12666/pyu-rc0402-51-rohs-l-6-r-12666741.pdf?src-supplier=Mouser; ComponentLink4Description: https://datasheet.ciiva.com/12666/pyu-rc0402-51-rohs-l-6-r-12666741.pdf?src-supplier=Mouser; ComponentLink5URL: https://datasheet.ciiva.com/7849/1018594-7849869.pdf?src-supplier=Element14; ComponentLink5Description: https://datasheet.ciiva.com/7849/1018594-7849869.pdf?src-supplier=Element14; ComponentLink6URL: https://datasheet.ciiva.com/7849/1018594-7849871.pdf?src-supplier=Element14; ComponentLink6Description: https://datasheet.ciiva.com/7849/1018594-7849871.pdf?src-supplier=Element14; ComponentLink7URL: https://datasheet.ciiva.com/17063/pyu-rc0402-51-rohs-l-6-r-17063193.pdf?src-supplier=Future+Electronics; ComponentLink7Description: https://datasheet.ciiva.com/17063/pyu-rc0402-51-rohs-l-6-r-17063193.pdf?src-supplier=Future+Electronics; Supplier Part Number 1: RC0402FR-071KL; LCSC Part Number: C106235
R140 R141 R148 R149 = RC2010FK-0722RL: RES 22 OHM 1% 750mW 2010
R142 R143 R150 R151 = RC0402FR-074K7L: RES 4.7K OHM 1% 1/16W 0402; Manufacturer: Yageo; Voltage Rating (DC): 50V; Power Rating: 62.5mW; Resistance: 4.7kR; Temperature Coefficient: 100ppm/°C; Max Power Dissipation: 63mW; Item Type: Resistor; Supplier 1: Avnet; Manufacturer Part Number: RC0402FR-074K7L; RoHS: Yes; Category: Chip SMD Resistors; Stock 1: 2420000; Pricing 1: 10000=0.00085 (USD); Case/Package: 0402; Number of Pins: 2; Case Code (Imperial): 0402; Case Code (Metric): 1005; Size Code: 0402; Min Operating Temperature: -55°C; Max Operating Temperature: 155°C; Tolerance: 1%; Voltage Rating: 50V; Packaging: Tape and Reel; Resistor Type: Thick Film; Termination: SMD/SMT; Features: Moisture Resistant; Series: RC; Number of Terminations: 2; Resistance Tolerance: 1%; Construction: Rectangular; Length: 1mm; Width: 0.5mm; Height: 0.32mm; Depth: 0.5mm; Height - Seated (Max): 0.016inch; RoHS Compliant: Yes; Reach SVHC Compliant: Yes; Military Standard: Not; Lead Free: Lead Free; ComponentLink1URL: https://datasheet.ciiva.com/22661/1686128-22661342.pdf?src-supplier=Element14; ComponentLink1Description: https://datasheet.ciiva.com/22661/1686128-22661342.pdf?src-supplier=Element14; ComponentLink2URL: https://datasheet.ciiva.com/7850/1018594-7850022.pdf?src-supplier=Element14; ComponentLink2Description: https://datasheet.ciiva.com/7850/1018594-7850022.pdf?src-supplier=Element14; ComponentLink3URL: https://datasheet.ciiva.com/7850/1018594-7850023.pdf?src-supplier=Element14; ComponentLink3Description: https://datasheet.ciiva.com/7850/1018594-7850023.pdf?src-supplier=Element14; ComponentLink4URL: https://datasheet.ciiva.com/15215/getdatasheetpartid-328119-15215035.pdf?src-supplier=Verical; ComponentLink4Description: https://datasheet.ciiva.com/15215/getdatasheetpartid-328119-15215035.pdf?src-supplier=Verical; Supplier Part Number 1: RC0402FR-074K7L; LCSC Part Number: C105871
R144 R145 R152 R153 = RC0402FR-0747KL: RES 47K OHM 1% 1/16W 0402; Manufacturer: Yageo; Power Rating: 62.5mW; Temperature Coefficient: 100ppm/°C; Voltage Rating: 50V; Resistance: 47kR; Max Power Dissipation: 63mW; Item Type: Resistor; Supplier 1: Avnet; Manufacturer Part Number: RC0402FR-0747KL; RoHS: Yes; Category: Chip SMD Resistors; Stock 1: 680000; Pricing 1: 10000=0.00085, 20000=0.00087, 40000=0.00084, 60000=0.00083, 80000=0.00079, 100000=0.00078, 1000000=0.00076 (USD); Case/Package: 0402; Case Code (Imperial): 0402; Case Code (Metric): 1005; Size Code: 0402; Min Operating Temperature: -55°C; Max Operating Temperature: 155°C; Tolerance: 1%; Series: RC; Packaging: Tape and Reel; Package Quantity: 1; Termination: SMD/SMT; Resistor Type: Thick Film; Number of Terminations: 2; Features: Moisture Resistant; Resistance Tolerance: 1%; Construction: Rectangular; Length: 1mm; Width: 0.02inch; Height: 0.016inch; Depth: 0.5mm; RoHS Compliant: Yes; Military Standard: Not; Lead Free: Lead Free; ComponentLink1URL: https://datasheet.ciiva.com/46412/1018594-46412839.pdf?src-supplier=Element14; ComponentLink1Description: https://datasheet.ciiva.com/46412/1018594-46412839.pdf?src-supplier=Element14; ComponentLink2URL: https://datasheet.ciiva.com/2453/pyu-r-int-thick-7-2453389.pdf?src-supplier=Digi-Key; ComponentLink2Description: https://datasheet.ciiva.com/2453/pyu-r-int-thick-7-2453389.pdf?src-supplier=Digi-Key; ComponentLink3URL: https://datasheet.ciiva.com/2453/pyu-r-int-thick-7-2453390.pdf?src-supplier=Digi-Key; ComponentLink3Description: https://datasheet.ciiva.com/2453/pyu-r-int-thick-7-2453390.pdf?src-supplier=Digi-Key; ComponentLink4URL: https://datasheet.ciiva.com/2453/pyu-r-int-thick-7-2453388.pdf?src-supplier=Digi-Key; ComponentLink4Description: https://datasheet.ciiva.com/2453/pyu-r-int-thick-7-2453388.pdf?src-supplier=Digi-Key; ComponentLink5URL: https://datasheet.ciiva.com/15189/getdatasheetpartid-323748-15189466.pdf?src-supplier=Verical; ComponentLink5Description: https://datasheet.ciiva.com/15189/getdatasheetpartid-323748-15189466.pdf?src-supplier=Verical; ComponentLink6URL: https://datasheet.ciiva.com/16793/pyu-rc0402-51-rohs-l-6-r-16793430.pdf?src-supplier=Future+Electronics; ComponentLink6Description: https://datasheet.ciiva.com/16793/pyu-rc0402-51-rohs-l-6-r-16793430.pdf?src-supplier=Future+Electronics; Supplier Part Number 1: RC0402FR-0747KL; LCSC Part Number: C93943
U16 = SN74HC14QDRQ1: IC INVERT SCHMITT 6CH 1IN 14SOIC; Manufacturer: Texas Instruments; Max Supply Voltage: 6V; Min Supply Voltage: 2V; Operating Supply Voltage: 5V; Propagation Delay: 21ns; Logic Function: Buffer,Inverter,Schmitt Trigger; Number of Elements: 6; Output Current: 25mA; Low Level Output Current: 5.2mA; Quiescent Current: 2uA; High Level Output Current: -5.2mA; Schmitt Trigger Input: Yes; Input Type: SCHMITT TRIGGER; Supplier: Mouser; Supplier Part Number: 595-SN74HC14QDRQ1; Manufacturer Part Number: SN74HC14QDRQ1; RoHS: Yes; Category: Logic Gates; Stock: 6966; Pricing: 1=0.68, 10=0.601, 50=0.601, 100=0.503, 1000=0.392, 10000=0.3 (USD); Mounting Technology: Surface Mount; Case/Package: SOIC; Pins: 14; Weight: 0.004318oz; Min Operating Temperature: -40°C; Max Operating Temperature: 125°C; Packaging: Tape and Reel; Package Quantity: 1; Number of Inputs: 6; Number of Circuits: 6; Turn-On Delay Time: 21ns; Number of Gates: 6; Number of Bits: 6; Series: 74HC; Technology: CMOS; Length: 8.65mm; Width: 3.91mm; Height: 1.58mm; Radiation Hardening: No; Reach SVHC Compliant: No; Lead Free: Lead Free; RoHS Compliant: Yes; ComponentLink1URL: https://datasheet.ciiva.com/15089/getdatasheetpartid-126971-15089251.pdf?src-supplier=Verical; ComponentLink1Description: https://datasheet.ciiva.com/15089/getdatasheetpartid-126971-15089251.pdf?src-supplier=Verical; ComponentLink2URL: https://datasheet.ciiva.com/1864/sn74hc14-q1-1864939.pdf?src-supplier=Digikey; ComponentLink2Description: https://datasheet.ciiva.com/1864/sn74hc14-q1-1864939.pdf?src-supplier=Digikey; ComponentLink3URL: https://datasheet.ciiva.com/1864/sn74hc14-q1-1864938.pdf?src-supplier=Digikey; ComponentLink3Description: https://datasheet.ciiva.com/1864/sn74hc14-q1-1864938.pdf?src-supplier=Digikey; ComponentLink4URL: https://datasheet.ciiva.com/1864/sn74hc14-q1-1864940.pdf?src-supplier=Digikey; ComponentLink4Description: https://datasheet.ciiva.com/1864/sn74hc14-q1-1864940.pdf?src-supplier=Digikey; ComponentLink5URL: https://datasheet.ciiva.com/14288/sn74hc14-q1-14288654.pdf?src-supplier=Avnet; ComponentLink5Description: https://datasheet.ciiva.com/14288/sn74hc14-q1-14288654.pdf?src-supplier=Avnet; ComponentLink6URL: https://datasheet.ciiva.com/48703/001073384-da-01-en-ic-hex-schmitt-sn74hc14qdrq1-soic-14-tid-48703180.pdf?src-supplier=Conrad; ComponentLink6Description: https://datasheet.ciiva.com/48703/001073384-da-01-en-ic-hex-schmitt-sn74hc14qdrq1-soic-14-tid-48703180.pdf?src-supplier=Conrad; LCSC Part Number: C507235; Item Type: IC
U17 U18 U20-U24 = PC817C: 70V 5kV 50mA 100mV@1mA,20mA 1 6V 1.2V DC SMD-4 Transistor Output Optocoupler ROHS; Manufacturer: Slkor; Item Type: IC; Manufacturer Part Number: PC817C; Package: SMD-4; LCSC Part Number: C2936043; ComponentLink1Description: LCSC; ComponentLink1URL: https://www.lcsc.com/product-detail/Transistor-Output-Optocoupler_Slkor-SLKORMICRO-Elec-PC817C_C2936043.html
U19 = 74LVC1G17GV,125: IC BUFFER SCHMITT TRIGGER 5TSOP; Manufacturer: Nexperia; Number of Channels: 1NUMBER; Supplier: Future Electronics; Supplier Part Number: 9876707; Manufacturer Part Number: 74LVC1G17GV,125; RoHS: Yes; Category: Logic Gates; Stock: 513000; Pricing: 3000=0.0334, 9000=0.0322, 30000=0.031, 60000=0.0303, 120000=0.029 (USD); Pins: 5NUMBER; Packaging: 10Packaging; RoHS Compliant: Yes; ComponentLink1URL: http://www.farnell.com/datasheets/2185283.pdf?src-supplier=Farnell; ComponentLink1Description: http://www.farnell.com/datasheets/2185283.pdf?src-supplier=Farnell; ComponentLink2URL: https://datasheet.octopart.com/74LVC1G17GV%2C125-Nexperia-datasheet-11799833.pdf?src-supplier=Farnell; ComponentLink2Description: https://datasheet.octopart.com/74LVC1G17GV%2C125-Nexperia-datasheet-11799833.pdf?src-supplier=Farnell; ComponentLink3URL: https://assets.nexperia.com/documents/data-sheet/74LVC1G17.pdf?src-supplier=Digikey; ComponentLink3Description: https://assets.nexperia.com/documents/data-sheet/74LVC1G17.pdf?src-supplier=Digikey; ComponentLink4URL: https://datasheet.octopart.com/74LVC1G17GV%2C125-Nexperia-datasheet-116120530.pdf?src-supplier=Future+Electronics; ComponentLink4Description: https://datasheet.octopart.com/74LVC1G17GV%2C125-Nexperia-datasheet-116120530.pdf?src-supplier=Future+Electronics; ComponentLink5URL: https://datasheet.octopart.com/74LVC1G17GV%2C125-Nexperia-datasheet-73818103.pdf?src-supplier=Element14; ComponentLink5Description: https://datasheet.octopart.com/74LVC1G17GV%2C125-Nexperia-datasheet-73818103.pdf?src-supplier=Element14; ComponentLink6URL: https://datasheet.octopart.com/74LVC1G17GV%2C125-NXP-Semiconductors-datasheet-13026859.pdf?src-supplier=Newark; ComponentLink6Description: https://datasheet.octopart.com/74LVC1G17GV%2C125-NXP-Semiconductors-datasheet-13026859.pdf?src-supplier=Newark; LCSC Part Number: C6076; Item Type: IC

## Sheet Connector-Sheet.SchDoc
size 420 x 297 mm; SheetNumber: 10; SheetTotal: 11
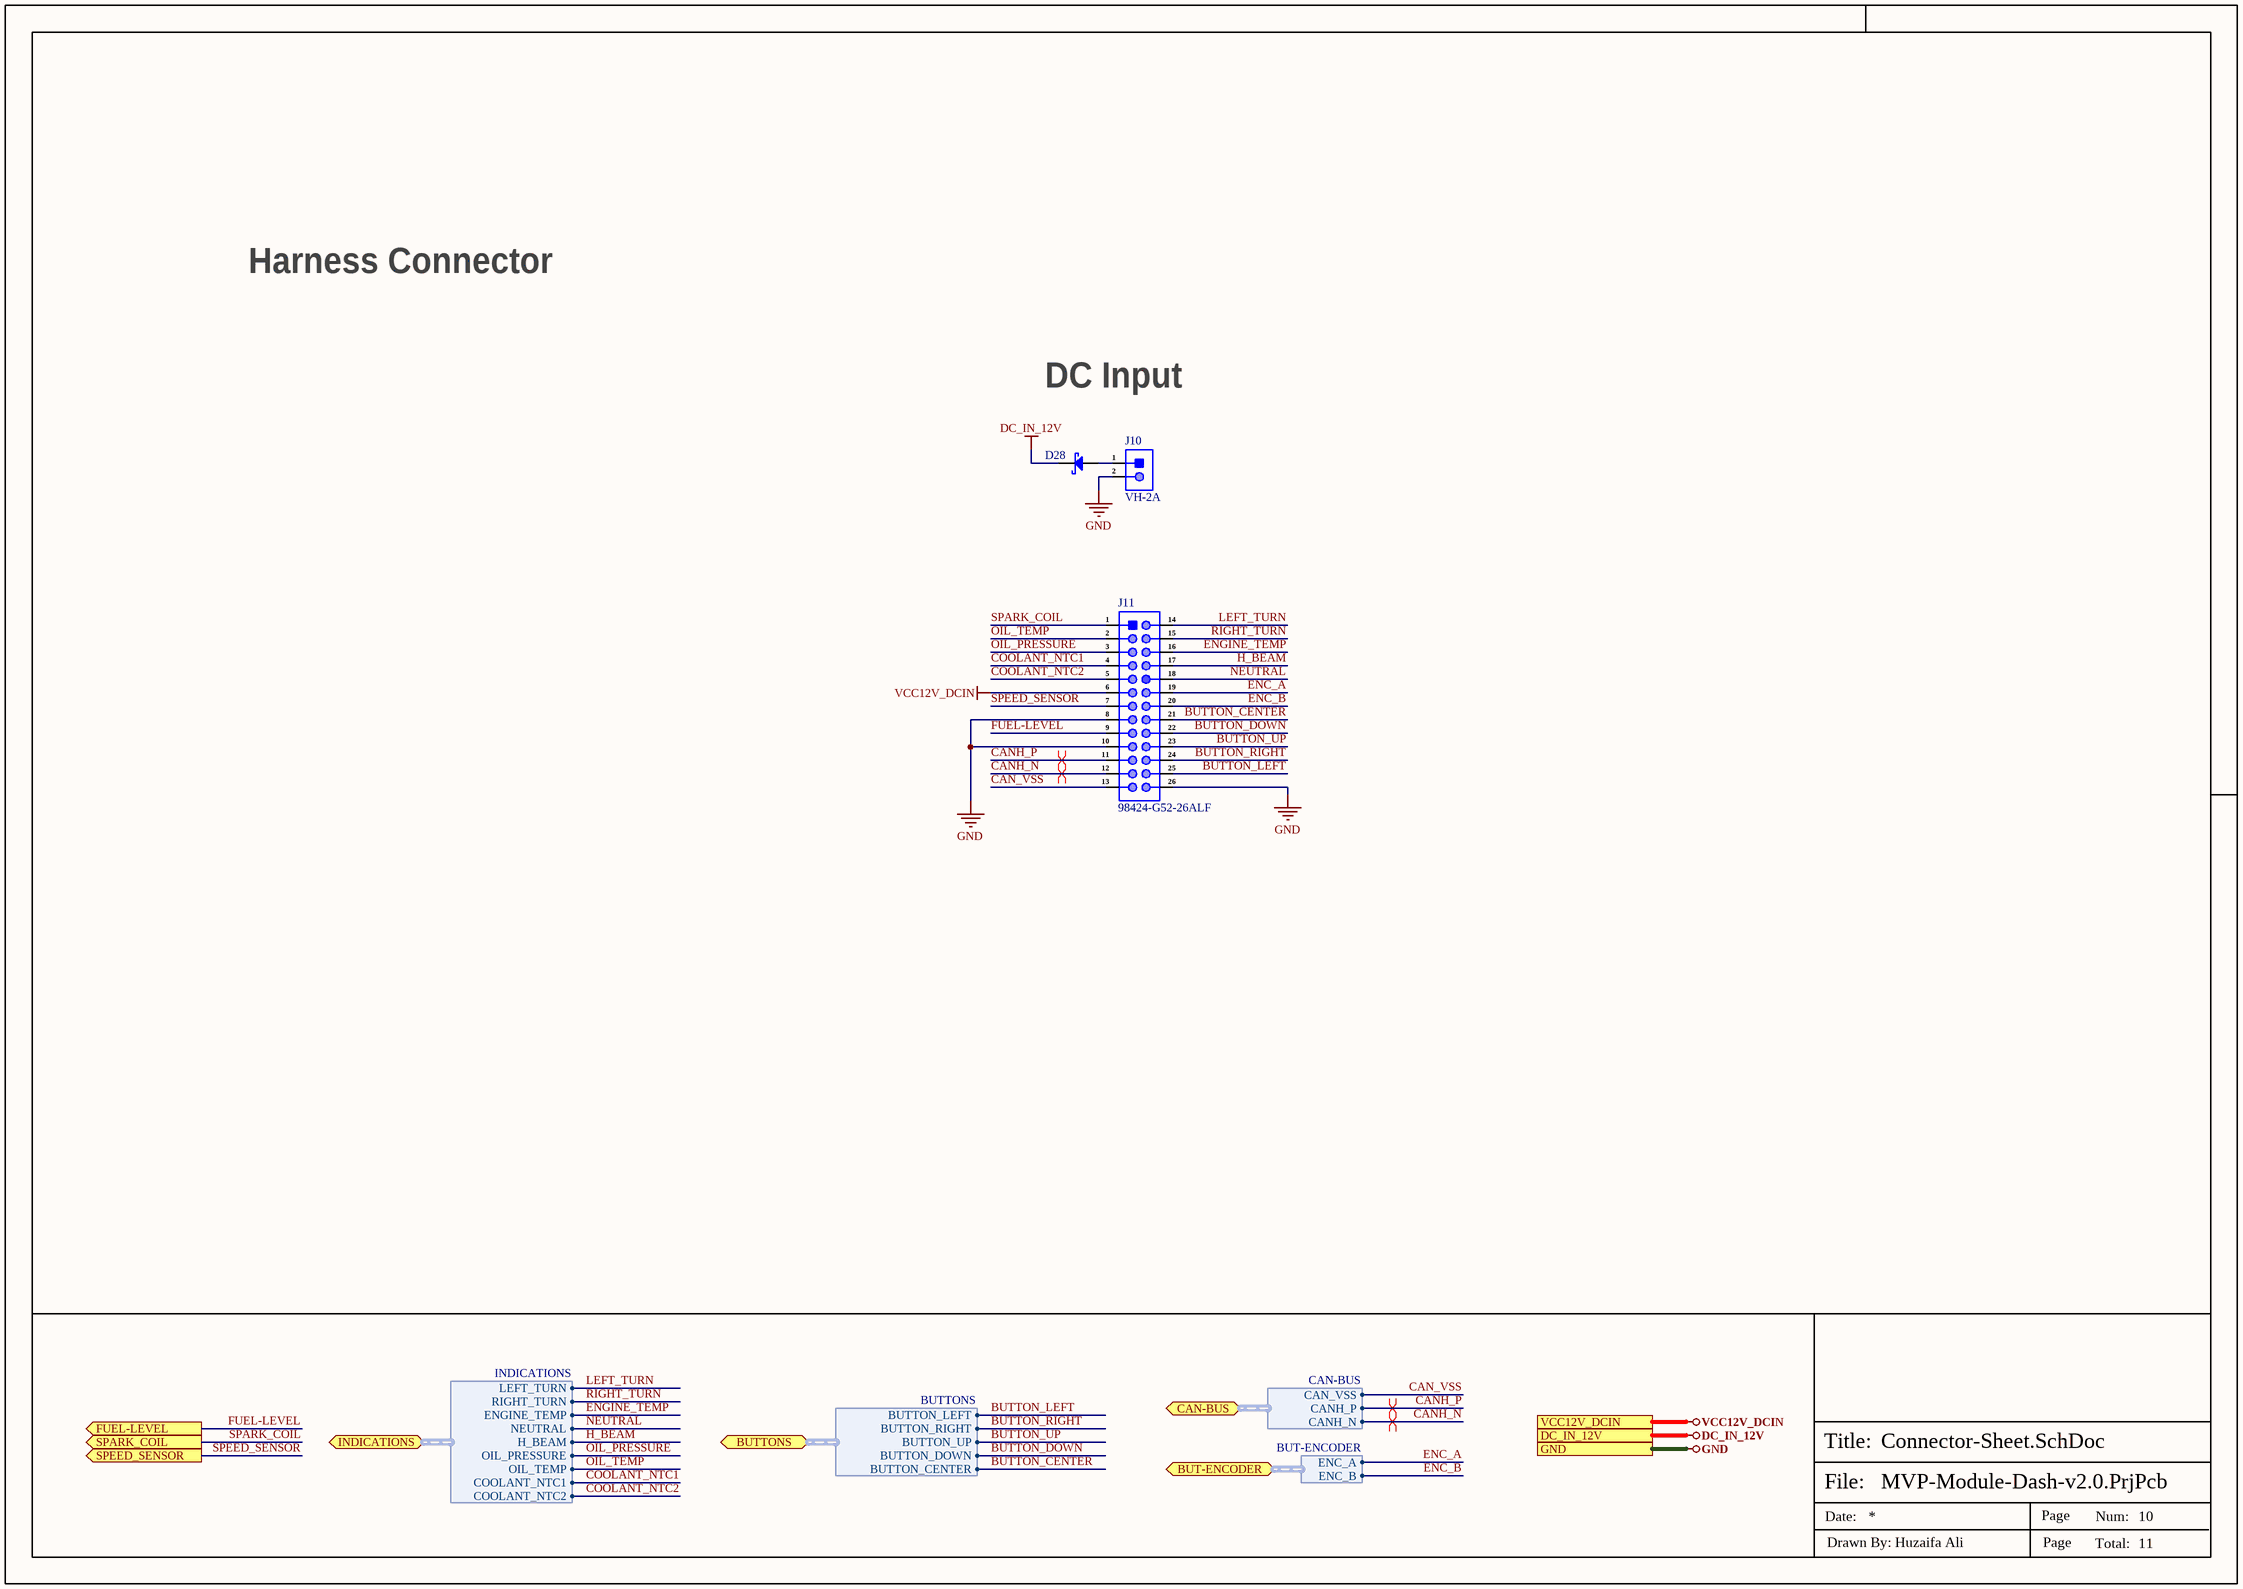
[diagram p13: Connector-Sheet.SchDoc]

### Parts
D28  SS34  [SMA]  (value not drawn)
J10  VH-2A  [VH-2A]
J11  98424-G52-26ALF  [98424-G52-26ALF]

### Ports
BUT-ENCODER (bidir, harness BUT-ENCODER, see Peripherals-Sheet-2[2D], TC-RK3568-Sheet[5C]), BUTTONS (bidir, harness BUTTONS, see Peripherals-Sheet-2[2D]), CAN-BUS (bidir, harness CAN-BUS, see CAN-Debug-Sheet[3D]), DC_IN_12V (see Power-Sheet[5D]), FUEL-LEVEL (out, see Peripherals-Sheet-1[6B]), GND (see CAN-Debug-Sheet[5D], HDMI-Sheet[5D], MIPI-Display-Sheet[5D], Peripherals-Sheet-1[5D], Peripherals-Sheet-2[5D], Power-Sheet[5D], TC-RK3568-Sheet[5D], TF-Card-Sheet[4D], USB-Sheet[5D], WiFi-Sheet[4D]), INDICATIONS (bidir, harness INDICATIONS, see Peripherals-Sheet-1[3D], Peripherals-Sheet-2[1D]), SPARK_COIL (out, see Peripherals-Sheet-1[1B]), SPEED_SENSOR (out, see Peripherals-Sheet-1[1D]), VCC12V_DCIN (see Peripherals-Sheet-1[5D], Power-Sheet[5D])

### Harnesses
BUTTONS: BUTTON_LEFT, BUTTON_RIGHT, BUTTON_UP, BUTTON_DOWN, BUTTON_CENTER
INDICATIONS: LEFT_TURN, RIGHT_TURN, ENGINE_TEMP, NEUTRAL, H_BEAM, OIL_PRESSURE, OIL_TEMP, COOLANT_NTC1, COOLANT_NTC2
CAN-BUS: CAN_VSS, CANH_P, CANH_N
BUT-ENCODER: ENC_A, ENC_B

### Nets
DC_IN_12V: D28.1(K) ; port DC_IN_12V
GND: J10.2 J11.8 J11.10 J11.26 ; port GND
VCC12V_DCIN: J11.6 ; port VCC12V_DCIN
BUTTON_CENTER: J11.21 ; port BUTTONS.BUTTON_CENTER
BUTTON_DOWN: J11.22 ; port BUTTONS.BUTTON_DOWN
BUTTON_LEFT: J11.25 ; port BUTTONS.BUTTON_LEFT
BUTTON_RIGHT: J11.24 ; port BUTTONS.BUTTON_RIGHT
BUTTON_UP: J11.23 ; port BUTTONS.BUTTON_UP
CAN_VSS: J11.13 ; port CAN-BUS.CAN_VSS
CANH_N: J11.12 ; port CAN-BUS.CANH_N
CANH_P: J11.11 ; port CAN-BUS.CANH_P
COOLANT_NTC1: J11.4 ; port INDICATIONS.COOLANT_NTC1
COOLANT_NTC2: J11.5 ; port INDICATIONS.COOLANT_NTC2
ENC_A: J11.19 ; port BUT-ENCODER.ENC_A
ENC_B: J11.20 ; port BUT-ENCODER.ENC_B
ENGINE_TEMP: J11.16 ; port INDICATIONS.ENGINE_TEMP
FUEL-LEVEL: J11.9 ; port FUEL-LEVEL
H_BEAM: J11.17 ; port INDICATIONS.H_BEAM
LEFT_TURN: J11.14 ; port INDICATIONS.LEFT_TURN
NEUTRAL: J11.18 ; port INDICATIONS.NEUTRAL
OIL_PRESSURE: J11.3 ; port INDICATIONS.OIL_PRESSURE
OIL_TEMP: J11.2 ; port INDICATIONS.OIL_TEMP
RIGHT_TURN: J11.15 ; port INDICATIONS.RIGHT_TURN
SPARK_COIL: J11.1 ; port SPARK_COIL
SPEED_SENSOR: J11.7 ; port SPEED_SENSOR
NetD28_2: D28.2(A) J10.1

### Layout directives
differential pair: CANH_N, CANH_P

### Notes on the sheet
- Harness Connector
- DC Input
- File:
- Title:
- Date:
- Page
- Num:
- Total:
- Drawn By: Huzaifa Ali

### Library data of the parts
D28 = SS34: 0.5mA@40V 40V Single 3A 0.55V@3A SMA(DO-214AC) Schottky Barrier Diodes (SBD) ROHS; Manufacturer: MDD; Item Type: Diode; Manufacturer Part Number: SS34; Package: SMA(DO-214AC); LCSC Part Number: C8678; ComponentLink1Description: LCSC; ComponentLink1URL: https://www.lcsc.com/product-detail/Schottky-Barrier-Diodes-SBD_MDD-Microdiode-Electronics-SS34_C8678.html
J10 = VH-2A: 2.00mm Pitch MicroClasp Wire-to-Board Header, Dual Row, Vertical, 24 Circuits, with PCB Locator; Manufacturer: BOOMELE; Item Type: Wire To Board Connector; Manufacturer Part Number: VH-2A; Package: Push-Pull,P=3.96mm; LCSC Part Number: C80347; ComponentLink1Description: LCSC; ComponentLink1URL: https://www.lcsc.com/product-detail/Wire-To-Board-span-style-background-color-ff0-Connector-span_BOOMELE-Boom-Precision-Elec-VH-2A_C80347.html; Supplier: Mouser; Supplier Part Number: 538-55917-2410; RoHS: Yes; Category: Headers and Wire Housings; Stock: 3772; Pricing: 1=1.36, 10=1.15, 50=1.15, 100=1.03, 1000=0.849, 10000=0.66 (USD); ComponentLink2URL: https://datasheet.ciiva.com/5156/0559172410-pcb-headers-171124-5156321.pdf?src-supplier=Mouser; ComponentLink2Description: https://datasheet.ciiva.com/5156/0559172410-pcb-headers-171124-5156321.pdf?src-supplier=Mouser
J11 = 98424-G52-26ALF: CONN HEADER SMD 26POS 2MM; Manufacturer: Amphenol ICC / FCI; Item Type: Headers and Wire Housings; Supplier: Avnet; Supplier Part Number: 65AC3204; Manufacturer Part Number: 98424-G52-26ALF; RoHS: Yes; Stock: 29; Pricing: 1=1.91 (USD); ComponentLink1URL: https://datasheet.ciiva.com/713/98424-713391.pdf?src-supplier=Digikey; ComponentLink1Description: https://datasheet.ciiva.com/713/98424-713391.pdf?src-supplier=Digikey; ComponentLink2URL: https://datasheet.ciiva.com/713/98424-713392.pdf?src-supplier=Digikey; ComponentLink2Description: https://datasheet.ciiva.com/713/98424-713392.pdf?src-supplier=Digikey; ComponentLink3URL: https://datasheet.ciiva.com/9473/98424-9473029.pdf?src-supplier=Avnet; ComponentLink3Description: https://datasheet.ciiva.com/9473/98424-9473029.pdf?src-supplier=Avnet; ComponentLink4URL: https://datasheet.ciiva.com/729/98424-729327.pdf?src-supplier=Digikey; ComponentLink4Description: https://datasheet.ciiva.com/729/98424-729327.pdf?src-supplier=Digikey; LCSC Part Number: C213188

## Nets that join several sheets
DC_IN_12V: Power-Sheet (C5.2 F1.1 P1.1 R1.2), Connector-Sheet (D28.1)
GND: TC-RK3568-Sheet (9 pins), Power-Sheet (33 pins), WiFi-Sheet (24 pins), USB-Sheet (25 pins), TF-Card-Sheet (11 pins), HDMI-Sheet (13 pins), MIPI-Display-Sheet (18 pins), CAN-Debug-Sheet (24 pins), Peripherals-Sheet-1 (32 pins), Peripherals-Sheet-2 (22 pins), Connector-Sheet (J10.2 J11.8 J11.10 J11.26)
VCC3V3_SD: TC-RK3568-Sheet (M1.24), TF-Card-Sheet (C38.2 C39.2 J4.4)
VCC3V3_SYS: TC-RK3568-Sheet (5 pins), Power-Sheet (11 pins), WiFi-Sheet (FB2.1), Peripherals-Sheet-1 (17 pins), Peripherals-Sheet-2 (18 pins)
VCC5V0_USB: Power-Sheet (R9.2), USB-Sheet (C27.2 C32.2 U4.5 U5.5)
VCC12V_DCIN: Power-Sheet (12 pins), Peripherals-Sheet-1 (5 pins), Peripherals-Sheet-2 (R131.1 R138.1 R139.1 R147.1), Connector-Sheet (J11.6)
VCC_1V8: TC-RK3568-Sheet (M1.26), WiFi-Sheet (R73.1), Peripherals-Sheet-1 (R94.2)
VCC_3V3: TC-RK3568-Sheet (M1.25), WiFi-Sheet (R53.2), HDMI-Sheet (C40.2 R30.2 R31.2 U6.24), MIPI-Display-Sheet (FB1.1 R35.2 R39.2), CAN-Debug-Sheet (5 pins)
VCC_5V0: Power-Sheet (R8.2), HDMI-Sheet (C42.2 U6.11), MIPI-Display-Sheet (C44.2 L3.1 U7.6), CAN-Debug-Sheet (C61.2 C62.2 U9.3), Peripherals-Sheet-2 (LED6.1 LED7.1 LED8.1 LED9.1)
BUTTON_CENTER: Peripherals-Sheet-2 (R127.1 U19.2), Connector-Sheet (J11.21)
BUTTON_CENTER#: TC-RK3568-Sheet (M1.66), Peripherals-Sheet-2 (U19.4)
BUTTON_DOWN: Peripherals-Sheet-2 (R124.1 U16.9), Connector-Sheet (J11.22)
BUTTON_DOWN#: TC-RK3568-Sheet (M1.68), Peripherals-Sheet-2 (U16.8)
BUTTON_LEFT: Peripherals-Sheet-2 (R121.1 U16.1), Connector-Sheet (J11.25)
BUTTON_LEFT#: TC-RK3568-Sheet (M1.71), Peripherals-Sheet-2 (U16.2)
BUTTON_RIGHT: Peripherals-Sheet-2 (R122.1 U16.3), Connector-Sheet (J11.24)
BUTTON_RIGHT#: TC-RK3568-Sheet (M1.70), Peripherals-Sheet-2 (U16.4)
BUTTON_UP: Peripherals-Sheet-2 (R123.1 U16.5), Connector-Sheet (J11.23)
BUTTON_UP#: TC-RK3568-Sheet (M1.69), Peripherals-Sheet-2 (U16.6)
CAN1_RX_M1: TC-RK3568-Sheet (M1.54), CAN-Debug-Sheet (R80.2)
CAN1_TX_M1: TC-RK3568-Sheet (M1.53), CAN-Debug-Sheet (R78.2)
CAN_VSS: CAN-Debug-Sheet (C63.2 C64.1 FB3.2), Connector-Sheet (J11.13)
CANH_N: CAN-Debug-Sheet (D15.1 R77.1 R81.2), Connector-Sheet (J11.12)
CANH_P: CAN-Debug-Sheet (D14.1 R76.1 R79.2), Connector-Sheet (J11.11)
CLK-32.768: Power-Sheet (U3.7), WiFi-Sheet (R72.1)
COOLANT_NTC1: Peripherals-Sheet-1 (R117.2), Connector-Sheet (J11.4)
COOLANT_NTC2: Peripherals-Sheet-1 (R119.1 U11.5), Connector-Sheet (J11.5)
ENC_A: Peripherals-Sheet-2 (R125.1 U16.11), Connector-Sheet (J11.19)
ENC_A#: TC-RK3568-Sheet (M1.63), Peripherals-Sheet-2 (U16.10)
ENC_B: Peripherals-Sheet-2 (R126.1 U16.13), Connector-Sheet (J11.20)
ENC_B#: TC-RK3568-Sheet (M1.64), Peripherals-Sheet-2 (U16.12)
ENGINE_TEMP: Peripherals-Sheet-2 (D25.2), Connector-Sheet (J11.16)
ENGINE_TEMP_SIG: TC-RK3568-Sheet (M1.114), Peripherals-Sheet-2 (R136.1 U22.4)
EXT_EN: TC-RK3568-Sheet (M1.15), Power-Sheet (R11.1)
FUEL-LEVEL: Peripherals-Sheet-1 (5 pins), Connector-Sheet (J11.9)
H_BEAM: Peripherals-Sheet-2 (R135.1), Connector-Sheet (J11.17)
H_BEAM_SIG: TC-RK3568-Sheet (M1.107), Peripherals-Sheet-2 (R133.1 U21.4)
HDMI_CT_HPD: TC-RK3568-Sheet (M1.22), HDMI-Sheet (R32.1 TP1.1)
HDMI_LS_OE: TC-RK3568-Sheet (M1.23), HDMI-Sheet (R33.1 TP2.1)
HDMI_TX0_N: TC-RK3568-Sheet (M1.151), HDMI-Sheet (J5.9 U6.17)
HDMI_TX0_P: TC-RK3568-Sheet (M1.152), HDMI-Sheet (J5.7 U6.18)
HDMI_TX1_N: TC-RK3568-Sheet (M1.153), HDMI-Sheet (J5.6 U6.20)
HDMI_TX1_P: TC-RK3568-Sheet (M1.154), HDMI-Sheet (J5.4 U6.21)
HDMI_TX2_N: TC-RK3568-Sheet (M1.155), HDMI-Sheet (J5.3 U6.22)
HDMI_TX2_P: TC-RK3568-Sheet (M1.156), HDMI-Sheet (J5.1 U6.23)
HDMI_TX_HPDIN: TC-RK3568-Sheet (M1.160), HDMI-Sheet (U6.4)
HDMI_TXCLK_N: TC-RK3568-Sheet (M1.149), HDMI-Sheet (J5.12 U6.15)
HDMI_TXCLK_P: TC-RK3568-Sheet (M1.150), HDMI-Sheet (J5.10 U6.16)
HDMITX_CEC_M0: TC-RK3568-Sheet (M1.159), HDMI-Sheet (U6.1)
HDMITX_SCL: TC-RK3568-Sheet (M1.157), HDMI-Sheet (U6.2)
HDMITX_SDA: TC-RK3568-Sheet (M1.158), HDMI-Sheet (U6.3)
I2C3_SCL_M0: TC-RK3568-Sheet (M1.109), Peripherals-Sheet-1 (U11.10)
I2C3_SDA_M0: TC-RK3568-Sheet (M1.110), Peripherals-Sheet-1 (U11.9)
I2C5_SCL_M0: TC-RK3568-Sheet (M1.51), Power-Sheet (R12.2)
I2C5_SDA_M0: TC-RK3568-Sheet (M1.50), Power-Sheet (R14.2)
LEFT_TURN: Peripherals-Sheet-2 (R130.1), Connector-Sheet (J11.14)
LEFT_TURN_SIG: TC-RK3568-Sheet (M1.106), Peripherals-Sheet-2 (R128.1 U17.4)
MIPI_DSI_TX0_CLK_N: TC-RK3568-Sheet (M1.144), MIPI-Display-Sheet (J6.18)
MIPI_DSI_TX0_CLK_P: TC-RK3568-Sheet (M1.143), MIPI-Display-Sheet (J6.17)
MIPI_DSI_TX0_D0_N: TC-RK3568-Sheet (M1.148), MIPI-Display-Sheet (J6.24)
MIPI_DSI_TX0_D0_P: TC-RK3568-Sheet (M1.147), MIPI-Display-Sheet (J6.23)
MIPI_DSI_TX0_D1_N: TC-RK3568-Sheet (M1.146), MIPI-Display-Sheet (J6.21)
MIPI_DSI_TX0_D1_P: TC-RK3568-Sheet (M1.145), MIPI-Display-Sheet (J6.20)
MIPI_DSI_TX0_D2_N: TC-RK3568-Sheet (M1.142), MIPI-Display-Sheet (J6.15)
MIPI_DSI_TX0_D2_P: TC-RK3568-Sheet (M1.141), MIPI-Display-Sheet (J6.14)
MIPI_DSI_TX0_D3_N: TC-RK3568-Sheet (M1.140), MIPI-Display-Sheet (J6.12)
MIPI_DSI_TX0_D3_P: TC-RK3568-Sheet (M1.139), MIPI-Display-Sheet (J6.11)
NetM1_27: TC-RK3568-Sheet (M1.27), CAN-Debug-Sheet (R89.1)
NetM1_28: TC-RK3568-Sheet (M1.28), CAN-Debug-Sheet (R88.1)
NetM1_59: TC-RK3568-Sheet (M1.59), Peripherals-Sheet-2 (R142.1)
NetM1_60: TC-RK3568-Sheet (M1.60), Peripherals-Sheet-2 (R150.1)
NetM1_61: TC-RK3568-Sheet (M1.61), Peripherals-Sheet-2 (R143.1)
NetM1_62: TC-RK3568-Sheet (M1.62), Peripherals-Sheet-2 (R151.1)
NetM1_65: TC-RK3568-Sheet (M1.65), MIPI-Display-Sheet (R40.1)
NetM1_72: TC-RK3568-Sheet (M1.72), WiFi-Sheet (R46.1)
NetM1_73: TC-RK3568-Sheet (M1.73), WiFi-Sheet (Q1.3 R53.1)
NetM1_74: TC-RK3568-Sheet (M1.74), WiFi-Sheet (R41.1)
NetM1_79: TC-RK3568-Sheet (M1.79), WiFi-Sheet (R48.1 U8.12)
NetM1_80: TC-RK3568-Sheet (M1.80), WiFi-Sheet (U8.13)
NetM1_111: TC-RK3568-Sheet (M1.111), Peripherals-Sheet-1 (R94.1 U11.2)
NetM1_137: TC-RK3568-Sheet (M1.137), MIPI-Display-Sheet (R36.1)
NetM1_197: TC-RK3568-Sheet (M1.197), USB-Sheet (R16.1)
NetM1_198: TC-RK3568-Sheet (M1.198), USB-Sheet (R19.1)
NEUTRAL: Peripherals-Sheet-2 (D24.2 LED8.2 R148.2), Connector-Sheet (J11.18)
NEUTRAL_SIG: TC-RK3568-Sheet (M1.108), Peripherals-Sheet-2 (R129.1 U18.4)
OIL_PRESSURE: Peripherals-Sheet-2 (D26.2), Connector-Sheet (J11.3)
OIL_PRESSURE_SIG: TC-RK3568-Sheet (M1.182), Peripherals-Sheet-2 (R137.1 U23.4)
OIL_TEMP: Peripherals-Sheet-2 (D27.2), Connector-Sheet (J11.2)
OIL_TEMP_SIG: TC-RK3568-Sheet (M1.115), Peripherals-Sheet-2 (R146.1 U24.4)
RESETn: TC-RK3568-Sheet (M1.12), CAN-Debug-Sheet (R83.2)
RIGHT_TURN: Peripherals-Sheet-2 (R134.1), Connector-Sheet (J11.15)
RIGHT_TURN_SIG: TC-RK3568-Sheet (M1.105), Peripherals-Sheet-2 (R132.1 U20.4)
RK809_PWRON: TC-RK3568-Sheet (M1.13), CAN-Debug-Sheet (R85.2)
SARADC_VIN0_KEY/RECOVERY: TC-RK3568-Sheet (M1.14), CAN-Debug-Sheet (R84.2)
SDMMC0_CLK: TC-RK3568-Sheet (M1.11), TF-Card-Sheet (D8.1 J4.5)
SDMMC0_CMD: TC-RK3568-Sheet (M1.10), TF-Card-Sheet (R26.1)
SDMMC0_D0: TC-RK3568-Sheet (M1.9), TF-Card-Sheet (R27.1)
SDMMC0_D1: TC-RK3568-Sheet (M1.8), TF-Card-Sheet (R28.1)
SDMMC0_D2/ARMJTAG_TCK: TC-RK3568-Sheet (M1.7), TF-Card-Sheet (R24.1)
SDMMC0_D3/ARMJTAG_TMS: TC-RK3568-Sheet (M1.6), TF-Card-Sheet (R25.1)
SDMMC0_DET_L: TC-RK3568-Sheet (M1.5), TF-Card-Sheet (R29.1)
SDMMC2_CLK_M0: TC-RK3568-Sheet (M1.81), WiFi-Sheet (R70.1)
SDMMC2_CMD_M0: TC-RK3568-Sheet (M1.82), WiFi-Sheet (R68.2 R69.1)
SDMMC2_D0_M0: TC-RK3568-Sheet (M1.86), WiFi-Sheet (R60.2 R61.1)
SDMMC2_D1_M0: TC-RK3568-Sheet (M1.85), WiFi-Sheet (R62.2 R63.1)
SDMMC2_D2_M0: TC-RK3568-Sheet (M1.84), WiFi-Sheet (R64.2 R65.1)
SDMMC2_D3_M0: TC-RK3568-Sheet (M1.83), WiFi-Sheet (R66.2 R67.1)
SPARK_COIL: Peripherals-Sheet-1 (R102.1), Connector-Sheet (J11.1)
SPEED_PWM: TC-RK3568-Sheet (M1.52), Peripherals-Sheet-1 (R118.1 U15.6)
SPEED_SENSOR: Peripherals-Sheet-1 (R120.1), Connector-Sheet (J11.7)
UART2_RX_M0_DEBUG: TC-RK3568-Sheet (M1.55), CAN-Debug-Sheet (R75.2)
UART2_TX_M0_DEBUG: TC-RK3568-Sheet (M1.56), CAN-Debug-Sheet (R74.2)
UART3_RX_M1: TC-RK3568-Sheet (M1.57), Peripherals-Sheet-1 (R99.1)
UART3_TX_M1: TC-RK3568-Sheet (M1.58), Peripherals-Sheet-1 (R98.1)
UART8_CTSn_M0: TC-RK3568-Sheet (M1.77), WiFi-Sheet (R56.2)
UART8_RTSn_M0: TC-RK3568-Sheet (M1.78), WiFi-Sheet (R49.2)
UART8_RX_M0: TC-RK3568-Sheet (M1.75), WiFi-Sheet (R52.2)
UART8_TX_M0: TC-RK3568-Sheet (M1.76), WiFi-Sheet (R50.2)
USB2_HOST2_D_N: TC-RK3568-Sheet (M1.117), USB-Sheet (R15.1)
USB2_HOST2_D_P: TC-RK3568-Sheet (M1.118), USB-Sheet (R18.1)
USB3_OTG0_D_N: TC-RK3568-Sheet (M1.193), USB-Sheet (J3.A7 J3.B7)
USB3_OTG0_D_P: TC-RK3568-Sheet (M1.194), USB-Sheet (J3.A6 J3.B6)